# EasyEDA Pro project honglin-first_crt_smartphone-e4cb491d.epro, board PCB_CRT手机
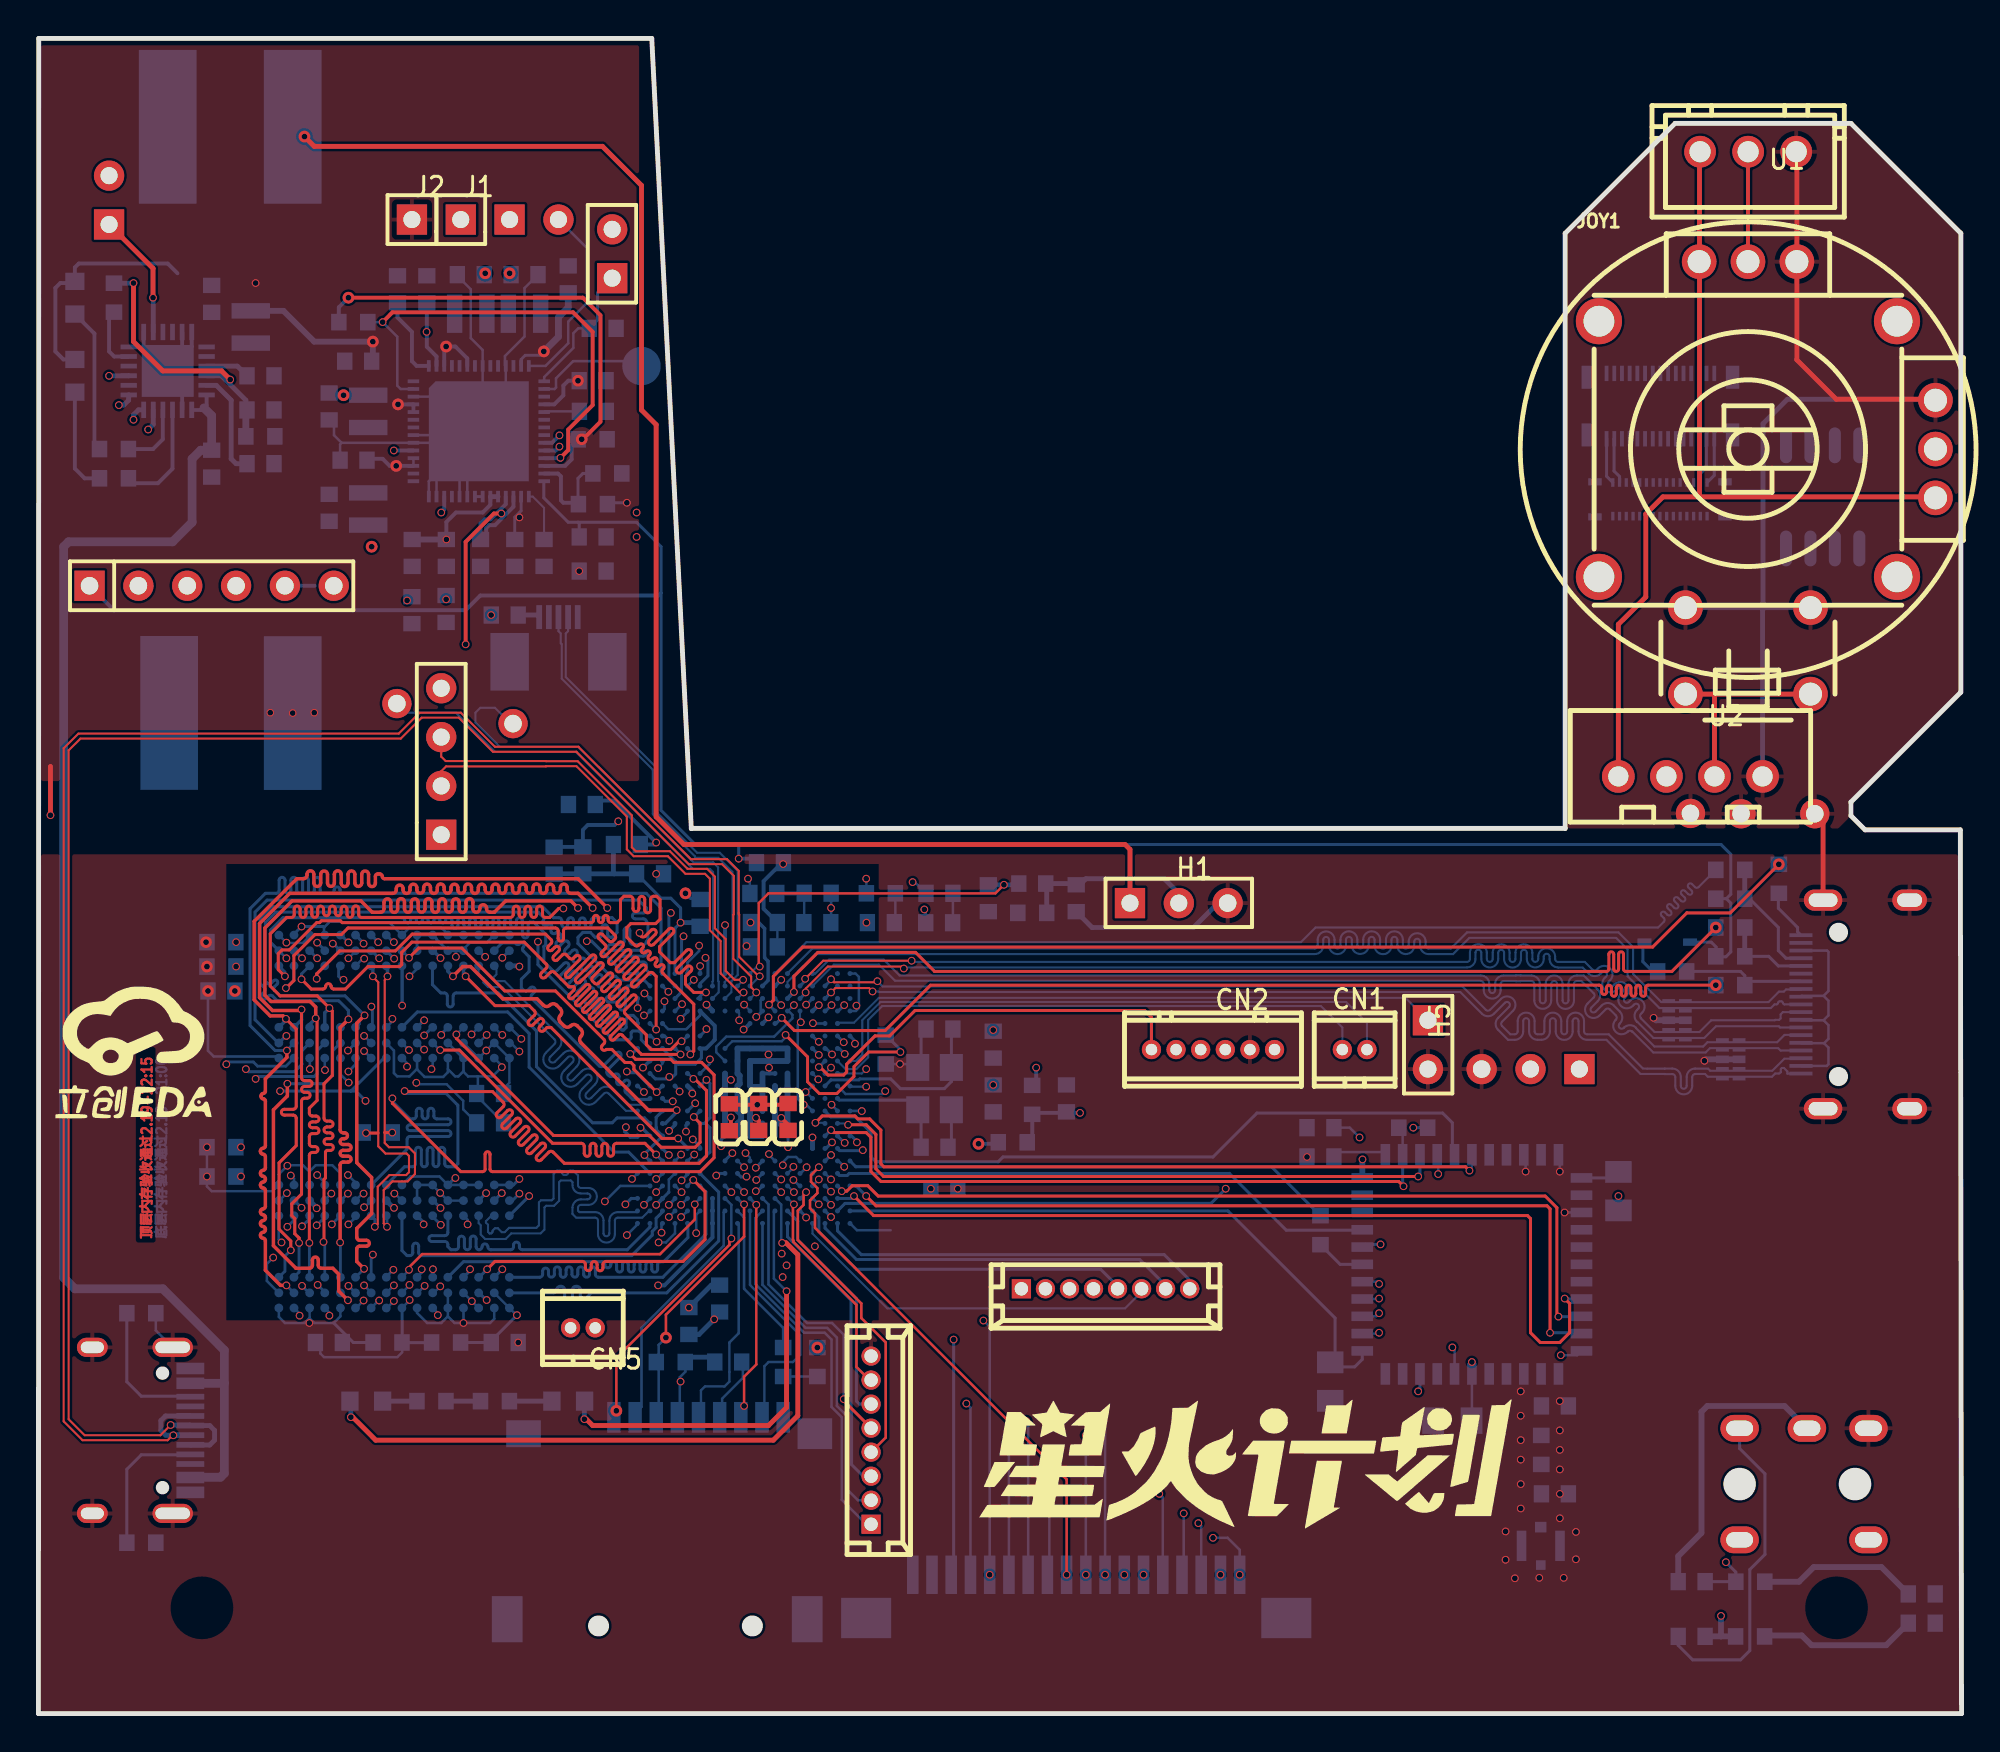
[diagram p7: board, top side]
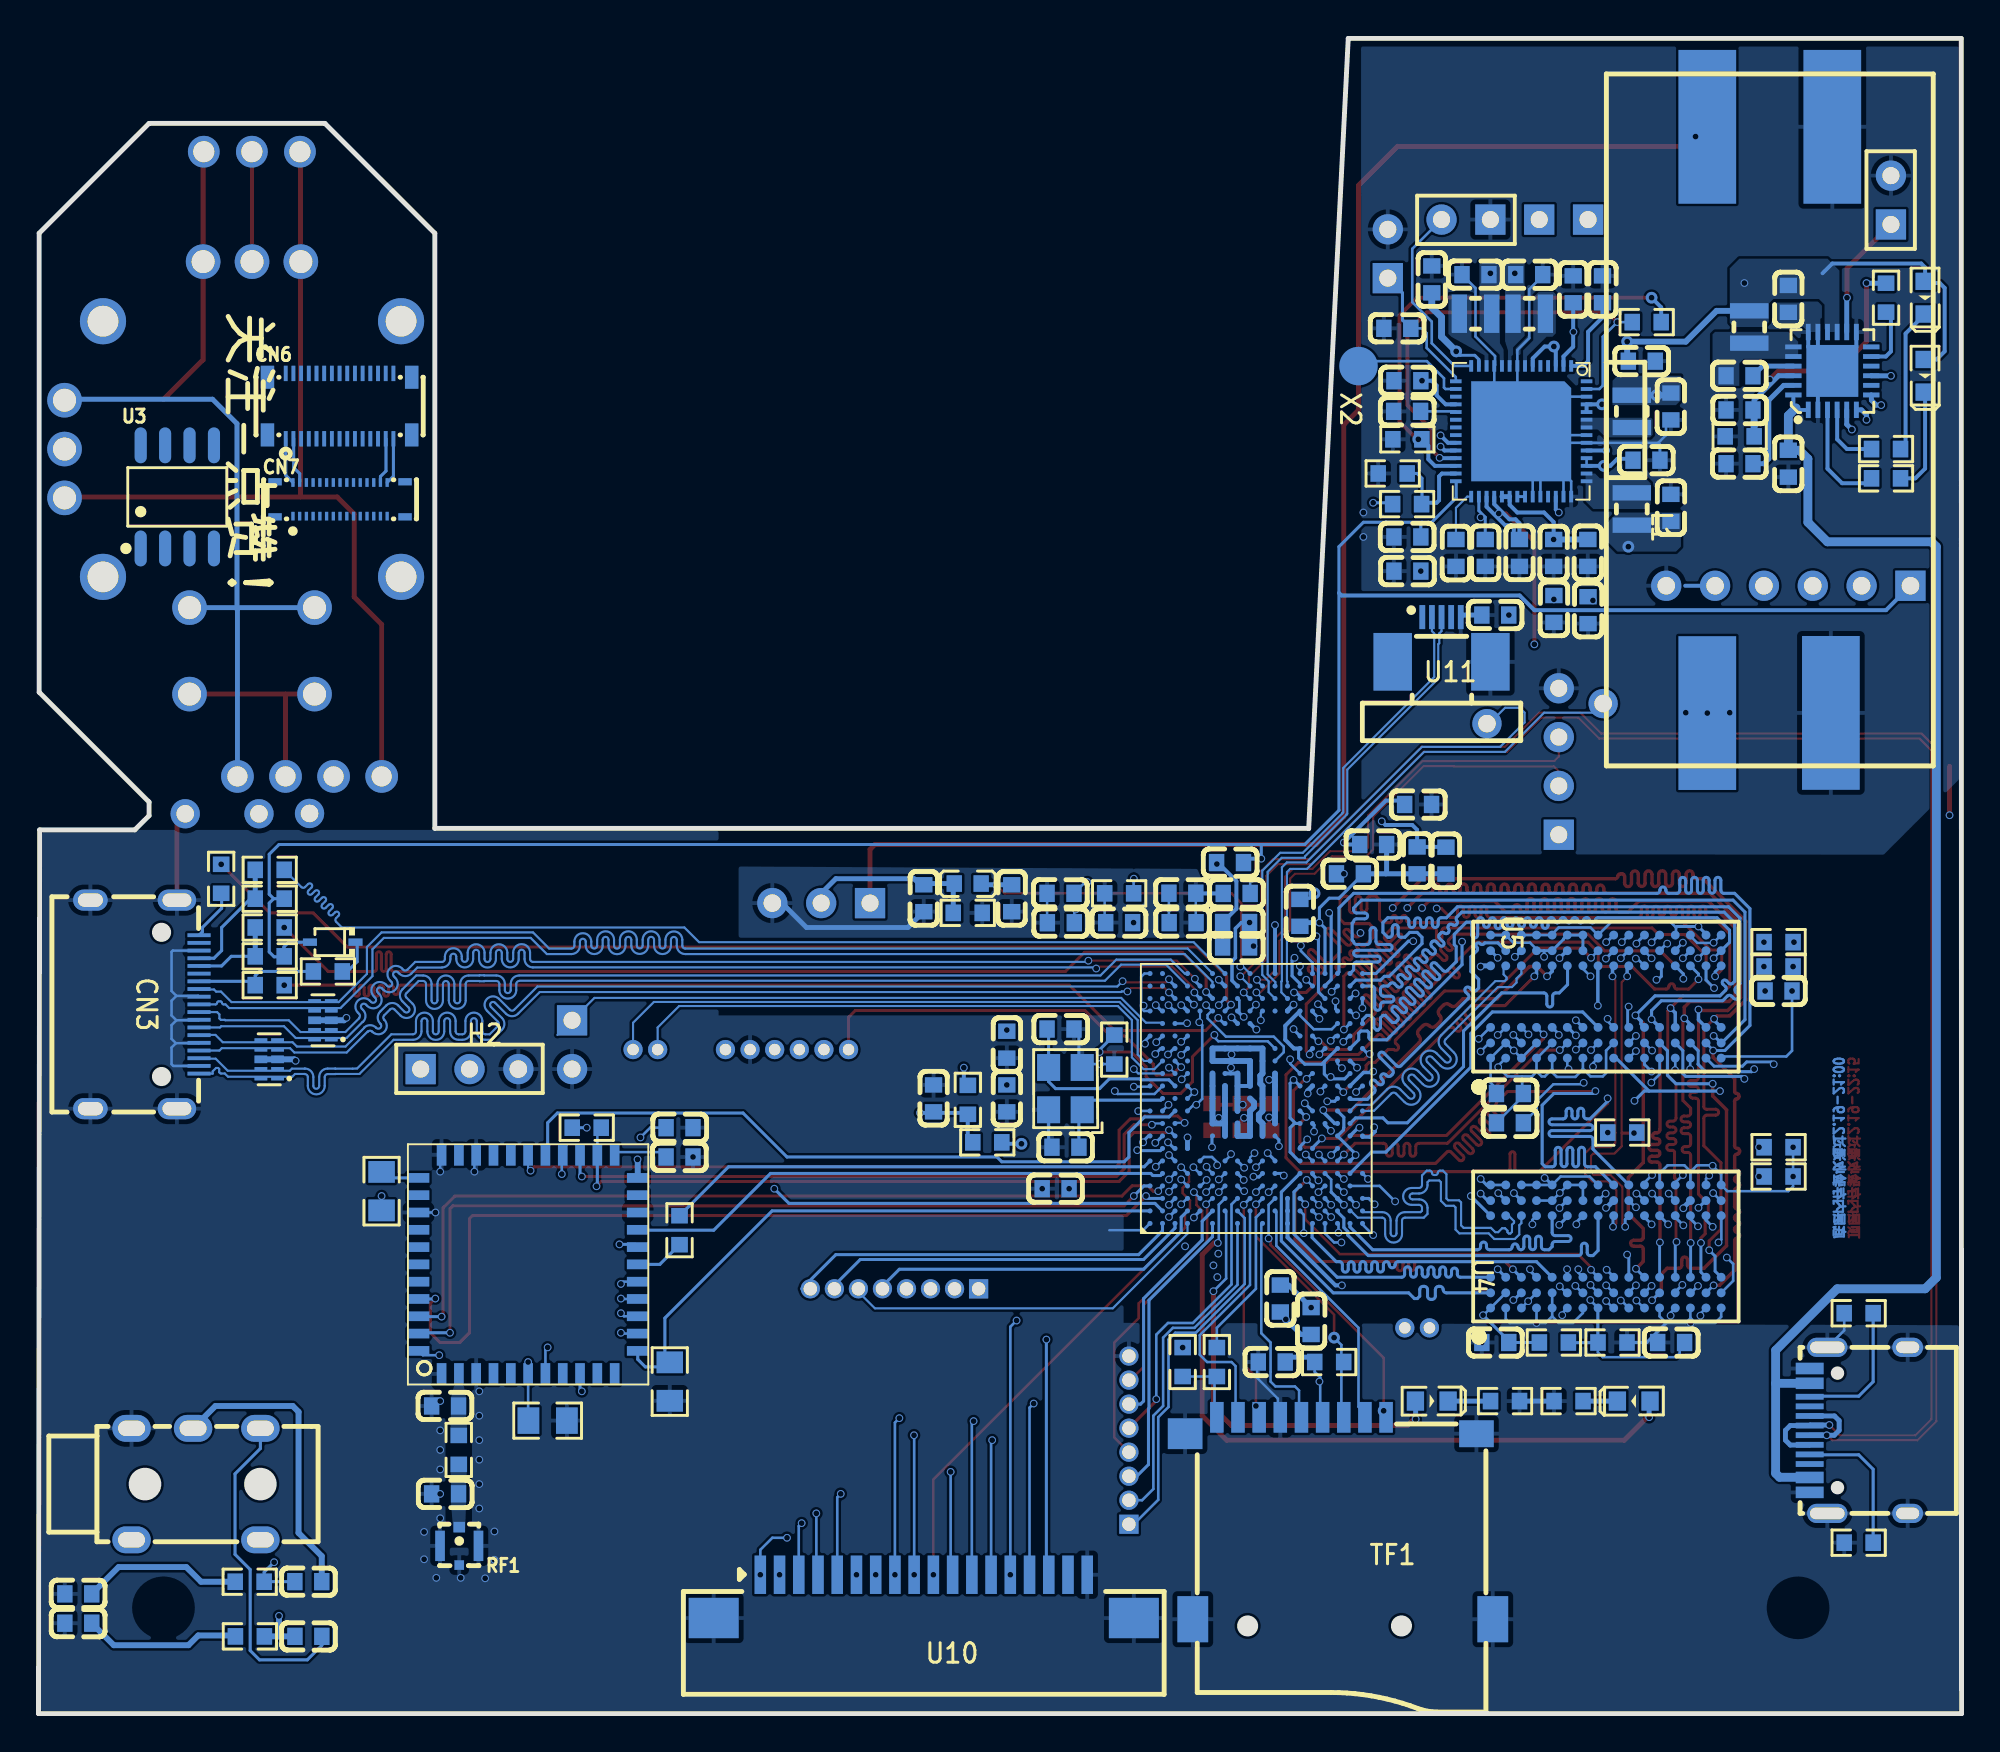
[diagram p8: board, bottom side, seen from below]

Outline 100 x 87.15 mm; copper layers: Top Layer, Inner1, Inner2, Inner3, Inner4, Bottom Layer. Coordinates in mm from the lower left corner of the outline.
Outline path: 0,0 100,0 99.94,45.97 94.99,45.97 94.25,46.71 94.25,47.42 99.96,53.14 99.96,77.01 94.25,82.73 85.1,82.73 79.39,77.01 79.39,46.05 33.96,46.05 33.95,46.04 31.89,87.15 0.01,87.15 0,0
Stack: Top Layer 0.035mm / Dielectric1 0.274mm PP er 4.5 / Inner1 0.035mm / Dielectric2 0.274mm PP er 4.5 / Inner2 0.035mm / Dielectric3 0.274mm FR4 er 4.5 / Inner3 0.035mm / Dielectric4 0.274mm PP er 4.5 / Inner4 0.035mm / Dielectric5 0.274mm PP er 4.5 / Bottom Layer 0.035mm

## Design rules (mm)
net H1: DP10
net H2: DP10
net H3: DP9
net H4: DP9
net H5: DP8
net H6: DP8
net H7: DP7
net H8: DP7
net SCKP: DP2
net SCKN: DP2
net USB_4G_MODULE_DP: DP11
net SDQS2P: DP4
net SDQS2N: DP4
net SDQS0N: DP6
net USB_MAIN_D-: DP14
net USB_MAIN_D+: DP14
net USB_KEYBOARD_D-: DP12
net USB_KEYBOARD_D+: DP12
net USB_4G_MODULE_DM: DP11
net SDQS1P: DP5
net SDQS3N: DP1
net SDQS0P: DP6
net SCKE1: DP3
net SDQS1N: DP5
net SCKE0: DP3
net SDQS3P: DP1
net $5N103: DP13
net $5N104: DP13
spacing Default (default): track to track 0.089, other pairs 0 to 0.152
spacing Plane_Default: track to track 0.089, other pairs 0 to 0.152
spacing Copper_copperRegion: track to track 0.089, other pairs 0 to 0.152
track width Default (default): min 0.089, default 0.178, max 25.4
differential pair 表层差分对: width min 0.109, default 0.109, max 2.54; gap min 0.152, default 0.152
differential pair 内层差分对 (default): width min 0.107, default 0.107, max 2.54; gap min 0.1, default 0.178
net SCS0 uses SA规则
net SA10 uses SA规则
net SDQ12 uses SDQ长度规则
net SDQ25 uses SDQ长度规则
net SDQ26 uses SDQ长度规则
net SDQ21 uses SDQ长度规则
net SDQ8 uses SDQ长度规则
net SDQ10 uses SDQ长度规则
net SDQ9 uses SDQ长度规则
net SDQ0 uses SDQ长度规则
net SODT1 uses SA规则
net SA7 uses SA规则
net SDQ5 uses SDQ长度规则
net SDQM0 uses SDQ长度规则
net SDQ2 uses SDQ长度规则
net SDQ13 uses SDQ长度规则
net SDQ15 uses SDQ长度规则
net SA6 uses SA规则
net SCAS uses SA规则
net SCS1 uses SA规则
net SODT0 uses SA规则
net SDQM3 uses SDQ长度规则
net SDQ4 uses SDQ长度规则
net SDQ1 uses SDQ长度规则
net SDQ20 uses SDQ长度规则
net SDQ19 uses SDQ长度规则
net SDQ17 uses SDQ长度规则
net SA4 uses SA规则
net SA15 uses SA规则
net SDQ6 uses SDQ长度规则
net SDQ3 uses SDQ长度规则
net SDQ23 uses SDQ长度规则
net SDQM2 uses SDQ长度规则
net SDQ18 uses SDQ长度规则
net SRAS uses SA规则
net SA2 uses SA规则
net SA3 uses SA规则
net SA9 uses SA规则
net SDQM1 uses SDQ长度规则
net SDQ11 uses SDQ长度规则
net SDQ29 uses SDQ长度规则
net SDQ31 uses SDQ长度规则
net SA1 uses SA规则
net SA8 uses SA规则
net SA13 uses SA规则
net SA5 uses SA规则
net SDQ7 uses SDQ长度规则
net SDQ14 uses SDQ长度规则
net SDQ22 uses SDQ长度规则
net SDQ27 uses SDQ长度规则
net SDQ16 uses SDQ长度规则
net SDQ30 uses SDQ长度规则
net SCKE1 uses SA规则
net SA14 uses SA规则
net SA12 uses SA规则
net SA11 uses SA规则
net SA0 uses SA规则
net SDQ28 uses SDQ长度规则
net SDQ24 uses SDQ长度规则
net SCKE0 uses SA规则
net SWE uses SA规则
pour e6898 uses Copper_copperRegion
pour e6953 uses Copper_copperRegion
pour e6983 uses Copper_copperRegion
pour e7125 uses Copper_copperRegion
pour e7131 uses Copper_copperRegion
pour e7165 uses Copper_copperRegion
pour e7350 uses Copper_copperRegion
pour e7438 uses Copper_copperRegion

## Placement (name value [footprint] x y rotation side)
C-AVCC-1  10uf 10v  [C0603]  46.85 42.67 180 bottom
C-AVCC-2  1uF  [C0603]  37.69 42.67 180 bottom
C-AVCC-3  470nF  [C0603]  46.84 41.14 180 bottom
C-AVCC-4  470nF  [C0603]  43.8 41.15 180 bottom
C-AVCC-5  470nF  [C0603]  53.96 42.42 90 bottom
C-AVCC-6  470nF  [C0603]  49.39 42.42 90 bottom
C-FILTER-1  47nF  [C0603]  9.51 37.59 180 bottom
C-FILTER-2  47nF  [C0603]  37.72 41.15 0 bottom
C-FILTER-3  47nF  [C0603]  24.25 19.3 0 bottom
C-FILTER-4  47nF  [C0603]  49.65 34.8 270 bottom
C-FILTER-5  47nF  [C0603]  21.2 57.47 270 bottom
C-FILTER-6  47nF  [C0603]  38.04 44.27 0 bottom
C-FILTER-7  47nF  [C0603]  31.8 43.69 180 bottom
C-FILTER-8  47nF  [C0603]  28.26 47.3 0 bottom
C-FILTER-9  47nF  [C0603]  24.25 57.15 180 bottom
C-FILTER-10  1uF  [C0603]  37.72 39.88 0 bottom
C-FILTER-11  1uF  [C0603]  19.42 57.4 270 bottom
C-FILTER-12  1uF  [C0603]  34.41 41.66 90 bottom
C-FILTER-13  1uF  [C0603]  35.42 21.59 270 bottom
C-FILTER-14  1uF  [C0603]  66.66 30.48 0 bottom
C-FILTER-15  1uF  [C0603]  35.92 31.02 270 top
C-FILTER-16  1uF  [C0603]  23.48 32.26 0 bottom
C-FILTER-17  1uF  [C0603]  47.11 27.31 180 bottom
C-FILTER-18  47uf  [C0603]  33.82 20.42 270 bottom
C-FILTER-19  1uF  [C0603]  28.31 44.39 90 bottom
C-FILTER-20  1uF  [C0603]  40.5 41.15 180 bottom
C-FILTER-21  1uF  [C0603]  40.52 42.68 0 bottom
C-FILTER-22  47nF  [C0603]  23.48 30.73 0 bottom
C-FILTER-23  47nF  [C0603]  15.1 19.3 0 bottom
C-PLL-1  12P  [C0603]  46.85 35.61 0 bottom
C-PLL-2  12P  [C0603]  46.6 29.46 0 bottom
C-PLL-3  220nF  [C0603]  49.65 32 270 bottom
C-POWER-1  10uf 10v  [C0603]  19.43 60.38 270 bottom
C-POWER-2  47uf  [C0603]  15.11 68 90 bottom
C-POWER-3  10uf 10v  [C0603]  21.21 60.38 90 bottom
C-POWER-4  10uf 10v  [C0603]  16.63 70.36 180 bottom
C-POWER-5  10uf 10v  [C0603]  28.82 59.44 0 bottom
C-POWER-6  10uf 10v  [C0603]  28.82 61.21 180 bottom
C-POWER-7  10uf 10v  [C0603]  22.99 60.38 270 bottom
C-POWER-8  10uf 10v  [C0603]  20.19 74.1 90 bottom
C-POWER-9  10uf 10v  [C0603]  18.67 74.1 90 bottom
C-POWER-10  10uf 10v  [C0603]  28.83 67.75 0 bottom
C-POWER-11  10uf 10v  [C0603]  24.77 60.38 270 bottom
C-POWER-12  10uf 10v  [C0603]  28.82 69.34 0 bottom
C-POWER-13  10uf 10v  [C0603]  27.55 74.61 90 bottom
C-POWER-14  10uf 10v  [C0603]  16.38 65.21 180 bottom
C-POWER-15  47uf  [C0603]  25.27 74.86 180 bottom
C-POWER-16  47uf  [C0603]  22.48 74.86 0 bottom
C-POWER-17  47uf  [C0603]  15.11 62.73 270 bottom
C-POWER-18  1uf 10v  [C0603]  26.29 60.38 90 bottom
C-POWER-19  10uf 10v  [C0603]  11.55 65.02 180 bottom
C-POWER-20  47nF  [C0603]  11.55 69.6 180 bottom
C-POWER-21  4.7uF  [C0603]  11.55 67.82 0 bottom
C-POWER-22  47uf  [C0603]  9.01 73.6 90 bottom
C-POWER-23  4.7uF  [C0603]  9.01 65.02 90 bottom
C-POWER-24  47uf  [C0603]  37.45 31.04 270 top
C-POWER-25  47uf  [C0603]  26.81 44.37 90 bottom
C-POWER-26  47uf  [C0603]  38.98 31.04 90 top
C-POWER-27  47uf  [C0603]  30.6 45.21 180 bottom
C-RESET-1  1nF  [C0603]  53.46 32 270 bottom
C-RESET-2  1nF  [C0603]  29.34 72.06 180 bottom
C-SOUND-1  1uF  [C0603]  85.97 6.86 0 bottom
C-SOUND-2  1uF  [C0603]  85.97 4.02 0 bottom
C-SOUND-3  47nF  [C0603]  97.93 6.23 180 bottom
C-SOUND-4  47nF  [C0603]  97.93 4.7 180 bottom
C_SD_1  10uf 10v  [C0603]  35.87 18.29 0 bottom
C_WIFI_1  NC  [C0603]  78.86 11.43 0 bottom
C_WIFI_2  NC  [C0603]  78.86 16 180 bottom
C_WIFI_3  47nF  [C0603]  66.66 28.96 180 bottom
CN1  Uart5  [CONN-TH_2P-P1.25_1.25T-2P-DP]  68.44 34.54 180 top
CN2  SPI引出  [CONN-TH_6P-P1.25_1.25T-6P-DP]  61.08 34.54 0 top
CN3  A71-05H4-111N1  [HDMI-SMD_A71-05H4-111N1]  94.47 36.89 270 bottom
CN4  KH-PJ-313  [AUDIO-TH_KH-PJ-313]  91.81 11.94 180 bottom
CN5  Uart5  [CONN-TH_2P-P1.25_1.25T-2P-DP]  28.31 20.07 180 top
CN6  AXT330124  [CONN-SMD_30P-P0.40_AXT330124]  84.34 68.02 180 bottom
CN7  X3500FVS-30A-LPV01  [CONN-SMD_30P-P0.35_XKB_X3500FVS-30A-LPV01]  84.32 63.17 180 bottom
D44  B5819WS_C169530  [SOD-323F_L2.0-W1.6-LS2.5-RD]  84.7 40.13 0 bottom
D45  RCLAMP0524P_C907837  [DFN2510-10_L2.5-W1.0-P0.50-BL]  88 34.04 90 bottom
D46  RCLAMP0524P_C907837  [DFN2510-10_L2.5-W1.0-P0.50-BL]  85.21 36.07 90 bottom
H1  屏幕接口  [HDR-F-2.54_1X3]  59.3 42.16 0 top
H2  Debug  [HDR-F-2.54_1X3]  77.59 33.53 180 bottom
H3  锂电池  [HDR-F-2.54_1X2]  3.67 78.74 90 bottom
H4  USB摄像头  [HDR-F-2.54_1X4]  20.94 49.53 90 top
H5  FEL下载模式  [HDR-F-2.54_1X2]  72.25 34.8 270 top
H6  复位  [HDR-F-2.54_1X2]  29.83 75.95 90 top
H7  Wake UP 可选  [HDR-F-2.54_1X2]  25.77 77.72 0 bottom
J1  使能屏幕  [HDR-M-2.54_1X1]  21.96 77.72 0 top
J2  电池供电  [HDR-M-2.54_1X1]  19.42 77.72 0 top
J3  Pin06  [PIN06]  9.01 58.67 90 top
JOY1  -  [joy]  88.89 65.79 0 top
JP1  串口和SPI  [CONN-TH_8P-P1.25_1.25T-1-8A]  55.49 22.1 0 top
JP2  IIC和GPIO  [CONN-TH_8P-P1.25_1.25T-1-8A]  43.3 14.22 90 top
L1  1.5uH  [IND-SMD_L2.0-W1.6_SUMIDA_201610CDMCDDS]  17.15 62.67 270 bottom
L2  1.5uH  [IND-SMD_L2.0-W1.6_SUMIDA_201610CDMCDDS]  11.04 72.14 90 bottom
L3  1.5uH  [IND-SMD_L2.0-W1.6_SUMIDA_201610CDMCDDS]  17.15 67.75 90 bottom
L4  1.5uH  [IND-SMD_L2.0-W1.6_SUMIDA_201610CDMCDDS]  22.48 72.83 0 bottom
L5  1.5uH  [IND-SMD_L2.0-W1.6_SUMIDA_201610CDMCDDS]  25.27 72.83 180 bottom
L6  默认一坨锡短路  [L0603]  51.68 43.18 0 bottom
LED1  LED-0603_R  [LED0603_RED]  27.55 16.26 180 bottom
LED2  LED-0603_G  [LED0603_GREEN]  17.05 16.26 0 bottom
LED3  LED-0603_G  [LED0603_GREEN]  1.89 69.6 270 bottom
LED4  LED-0603_R  [LED0603_RED]  1.89 73.66 270 bottom
NOREF  -  [Pad_e493]  18.64 52.55 0 top
NOREF#2  -  [Pad_e492]  24.68 51.5 0 top
NOREF#3  -  [Pad_e496]  85.9 46.83 0 top
NOREF#4  -  [Pad_e495]  88.53 46.81 0 top
NOREF#5  -  [Pad_e494]  92.37 46.81 0 top
R-AV-1  150k  [R0603]  43.8 42.67 180 bottom
R-AV-2  100Ω  [R0603]  51.68 41.66 180 bottom
R-POWER-1  10kΩ  [R0603]  28.82 66.29 180 bottom
R-POWER-2  10kΩ  [R0603]  16.37 72.39 180 bottom
R-POWER-3  10kΩ  [R0603]  3.93 73.66 270 bottom
R-POWER-4  10kΩ  [R0603]  11.54 66.45 180 bottom
R-POWER-5  10kΩ  [R0603]  5.35 20.83 180 bottom
R-POWER-6  10kΩ  [R0603]  5.35 8.89 180 bottom
R-POWER-7  10kΩ  [R0603]  28.83 62.92 0 bottom
R-POWER-8  10kΩ  [R0603]  29.58 64.52 0 bottom
R-RESET-1  10kΩ  [R0603]  50.66 29.72 180 bottom
R-RESET-2  100Ω  [R0603]  51.67 31.93 270 bottom
R_HDMI_1  1k  [R0603]  90.5 43.43 90 bottom
R_HDMI_2  100  [R0603]  87.97 40.89 180 bottom
R_HDMI_3  100  [R0603]  87.97 43.89 180 bottom
R_HDMI_4  1k8  [R0603]  87.97 39.39 180 bottom
R_HDMI_5  1k8  [R0603]  87.97 42.39 180 bottom
R_HDMI_6  100  [R0603]  87.97 37.89 180 bottom
R_HDMI_7  27K  [R0603]  84.95 38.61 180 bottom
R_LED_1  1k  [R0603]  20.44 16.26 0 bottom
R_LED_2  1k  [R0603]  23.74 16.26 180 bottom
R_LED_3  1k  [R0603]  3.93 65.79 0 bottom
R_LED_4  1k  [R0603]  3.93 64.26 0 bottom
R_SD_1  510  [R0603]  38.72 18.29 90 bottom
R_SD_2  100k  [R0603]  32.88 18.29 180 bottom
R_SD_3  100k  [R0603]  40.5 18.29 270 bottom
R_SOUND_1  33Ω  [R0603]  89.02 6.86 0 bottom
R_SOUND_2  33Ω  [R0603]  89.01 4.02 0 bottom
R_WIFI_1  33Ω  [R0603]  66.66 25.15 90 bottom
R_WIFI_2  100k  [R0805]  67.17 17.27 90 bottom
R_WIFI_3  0  [R0805]  82.16 27.18 90 bottom
R_WIFI_4  100k  [R0805]  73.52 15.24 0 bottom
R_WIFI_5  0  [R0603]  78.15 13.72 90 bottom
R_WIFI_6  10kΩ  [R0603]  71.49 30.48 180 bottom
RF1  HC-RF-IPEX2020-04  [IPEX-SMD_HC-RF-IPEX2020-04]  78.12 8.71 0 bottom
RRAM1  240  [R0603]  9.51 27.94 0 bottom
RRAM2  240  [R0603]  9.51 29.46 0 bottom
RRAM3  240  [R0603]  9.51 40.13 0 bottom
RRAM4  240  [R0603]  9.51 38.86 0 bottom
RRAM5  240  [R0603]  44.06 34.54 90 bottom
RRAM6  1k  [R0603]  21.2 19.3 180 bottom
RRAM7  1k  [R0603]  18.15 19.3 180 bottom
RRAM8  100  [R0603]  17.64 30.23 180 bottom
TF1  SD  [TF-SMD_TF-15-15]  32.37 10.16 270 bottom
U1  XH2.54-3P 直插  [CONN-TH_XH2.54-3P]  88.9 81.25 0 top
U2  XH2.54_4P_直插  [CONN-TH_4P-P2.50-XH2.54-4P]  85.9 48.75 180 top
U3  H616  [SOP-8_L4.9-W3.9-P1.27-LS6.0-BL]  92.78 63.3 180 bottom
U3#2  -  [H616]  37 32 180 bottom
U4  -  [K4B4G1646E]  20.5 23.5 90 bottom
U5  -  [K4B4G1646E]  20.5 36.5 90 bottom
U6  BQ25601DRTWR  [WQFN-24_L4.0-W4.0-P0.50-TL-EP2.7]  6.72 69.85 90 bottom
U7  AXP305 COPY  [AXP305]  22.9 66.71 270 bottom
U8  -  [升压模块[MT3608]]  8.5 67.31 90 bottom
U9  -  [AW859A]  74.54 23.37 90 bottom
U10  以太网引出  [FPC-SMD_XUNPU_FPC-1.0AS-18PWBH25]  53.96 6.1 180 bottom
U11  USB网卡  [FPC-SMD_5P-P0.50_XUNPU_FPC-0.5AX-5PWBH20]  27.04 55.88 180 bottom
USB1  USB充电  [USB-C-SMD_TYPEC-304-BCP16]  5.35 14.73 90 bottom
X2  TP  [TP_SMD]  31.36 70.1 270 bottom
X3  24MHz  [OSC-SMD_4P-L3.2-W2.5-BL]  46.6 32.51 90 bottom

## Footprints (pads in the part's own frame, mm; a bottom-side part is the same pattern mirrored in y, then rotated)
AUDIO-TH_KH-PJ-313
  oval 2x1.4 hole 1.4x0.8: 1(-3.35,2.9) 2(3.35,2.9) 3(-0.15,2.9) 4(-3.35,-2.9) 5(3.35,-2.9)
AW859A
  rect 1.125x0.5 smd: 1(-5.7,4.5) 2(-5.7,3.6) 3(-5.7,2.7) 4(-5.7,1.8) 5(-5.7,0.9) 6(-5.7,0) 7(-5.7,-0.9) 8(-5.7,-1.8) 9(-5.7,-2.7) 10(-5.7,-3.6) 11(-5.7,-4.5) 23(5.7,-4.5) 24(5.7,-3.6) 25(5.7,-2.7) 26(5.7,-1.8) 27(5.7,-0.9) 28(5.7,0) 29(5.7,0.9) 30(5.7,1.8) 31(5.7,2.7) 32(5.7,3.6) 33(5.7,4.5)
  rect 0.5x1.125 smd: 12(-4.5,-5.7) 13(-3.6,-5.7) 14(-2.7,-5.7) 15(-1.8,-5.7) 16(-0.9,-5.7) 17(0,-5.7) 18(0.9,-5.7) 19(1.8,-5.7) 20(2.7,-5.7) 21(3.6,-5.7) 22(4.5,-5.7) 34(4.5,5.7) 35(3.6,5.7) 36(2.7,5.7) 37(1.8,5.7) 38(0.9,5.7) 39(0,5.7) 40(-0.9,5.7) 41(-1.8,5.7) 42(-2.7,5.7) 43(-3.6,5.7) 44(-4.5,5.7)
AXP305
  rect 0.6x0.2 smd: 1(-3.4,2.6) 2(-3.4,2.2) 3(-3.4,1.8) 4(-3.4,1.4) 5(-3.4,1) 6(-3.4,0.6) 7(-3.4,0.2) 8(-3.4,-0.2) 9(-3.4,-0.6) 10(-3.4,-1) 11(-3.4,-1.4) 12(-3.4,-1.8) 13(-3.4,-2.2) 14(-3.4,-2.6) 29(3.4,-2.6) 30(3.4,-2.2) 31(3.4,-1.8) 32(3.4,-1.4) 33(3.4,-1) 34(3.4,-0.6) 35(3.4,-0.2) 36(3.4,0.2) 37(3.4,0.6) 38(3.4,1) 39(3.4,1.4) 40(3.4,1.8) 41(3.4,2.2) 42(3.4,2.6)
  rect 0.2x0.6 smd: 15(-2.6,-3.4) 16(-2.2,-3.4) 17(-1.8,-3.4) 18(-1.4,-3.4) 19(-1,-3.4) 20(-0.6,-3.4) 21(-0.2,-3.4) 22(0.2,-3.4) 23(0.6,-3.4) 24(1,-3.4) 25(1.4,-3.4) 26(1.8,-3.4) 27(2.2,-3.4) 28(2.6,-3.4) 43(2.6,3.4) 44(2.2,3.4) 45(1.8,3.4) 46(1.4,3.4) 47(1,3.4) 48(0.6,3.4) 49(0.2,3.4) 50(-0.2,3.4) 51(-0.6,3.4) 52(-1,3.4) 53(-1.4,3.4) 54(-1.8,3.4) 55(-2.2,3.4) 56(-2.6,3.4)
  custom 5.2x5.2 smd: 57(0,0)
C0603
  rect 0.8x0.9 smd: 1(-0.7,0) 2(0.7,0)
CONN-SMD_30P-P0.35_XKB_X3500FVS-30A-LPV01
  rect 0.17x0.45 smd: 1(-2.45,-0.875) 2(-2.45,0.875) 3(-2.1,-0.875) 4(-2.1,0.875) 5(-1.75,-0.875) 6(-1.75,0.875) 7(-1.4,-0.875) 8(-1.4,0.875) 9(-1.05,-0.875) 10(-1.05,0.875) 11(-0.7,-0.875) 12(-0.7,0.875) 13(-0.35,-0.875) 14(-0.35,0.875) 15(0,-0.875) 16(0,0.875) 17(0.35,-0.875) 18(0.35,0.875) 19(0.7,-0.875) 20(0.7,0.875) 21(1.05,-0.875) 22(1.05,0.875) 23(1.4,-0.875) 24(1.4,0.875) 25(1.75,-0.875) 26(1.75,0.875) 27(2.1,-0.875) 28(2.1,0.875) 29(2.45,-0.875) 30(2.45,0.875)
  rect 0.7x0.375 smd: 31(3.38,-0.912) 31(3.38,0.912) 32(-3.38,-0.912) 32(-3.38,0.912)
CONN-SMD_30P-P0.40_AXT330124
  rect 0.2x0.8 smd: 1(-2.8,-1.7) 2(-2.8,1.7) 3(-2.4,-1.7) 4(-2.4,1.7) 5(-2,-1.7) 6(-2,1.7) 7(-1.6,-1.7) 8(-1.6,1.7) 9(-1.2,-1.7) 10(-1.2,1.7) 11(-0.8,-1.7) 12(-0.8,1.7) 13(-0.4,-1.7) 14(-0.4,1.7) 15(0,-1.7) 16(0,1.7) 17(0.4,-1.7) 18(0.4,1.7) 19(0.8,-1.7) 20(0.8,1.7) 21(1.2,-1.7) 22(1.2,1.7) 23(1.6,-1.7) 24(1.6,1.7) 25(2,-1.7) 26(2,1.7) 27(2.4,-1.7) 28(2.4,1.7) 29(2.8,-1.7) 30(2.8,1.7)
  rect 0.7x1.2 smd: 31(3.75,-1.5) 32(3.75,1.5) 33(-3.75,-1.5) 34(-3.75,1.5)
CONN-TH_2P-P1.25_1.25T-2P-DP
  round 1 hole 0.6: 1(-0.64,0) 2(0.64,0)
CONN-TH_4P-P2.50-XH2.54-4P
  round 1.7 hole 1.05: 1(3.75,0) 2(1.25,0) 3(-1.25,0) 4(-3.75,0)
CONN-TH_6P-P1.25_1.25T-6P-DP
  round 1 hole 0.6: 1(-3.2,0) 2(-1.92,0) 3(-0.64,0) 4(0.64,0) 5(1.921,0) 6(3.2,0)
CONN-TH_8P-P1.25_1.25T-1-8A
  rect 1x1 hole 0.7: 1(-4.375,0)
  round 1 hole 0.7: 2(-3.125,0) 3(-1.875,0) 4(-0.625,0) 5(0.625,0) 6(1.875,0) 7(3.125,0) 8(4.375,0)
CONN-TH_XH2.54-3P
  round 1.65 hole 1.1: 1(-2.5,0) 2(0,0) 3(2.5,0)
DFN2510-10_L2.5-W1.0-P0.50-BL
  rect 0.2x0.665 smd: 1(-1,-0.433) 2(-0.5,-0.433) 4(0.5,-0.433) 5(1,-0.433) 6(1,0.433) 7(0.5,0.433) 9(-0.5,0.433) 10(-1,0.433)
  rect 0.4x0.665 smd: 3(0,-0.433) 8(0,0.433)
FPC-SMD_5P-P0.50_XUNPU_FPC-0.5AX-5PWBH20
  rect 0.3x1.25 smd: 1(-1,1.163) 2(-0.5,1.163) 3(0,1.163) 4(0.5,1.163) 5(1,1.163)
  rect 2x3 smd: 6(2.54,-1.163) 7(-2.54,-1.163)
FPC-SMD_XUNPU_FPC-1.0AS-18PWBH25
  rect 0.6x2 smd: 1(-8.5,1.125) 2(-7.5,1.125) 3(-6.5,1.125) 4(-5.5,1.125) 5(-4.5,1.125) 6(-3.5,1.125) 7(-2.5,1.125) 8(-1.5,1.125) 9(-0.5,1.125) 10(0.5,1.125) 11(1.5,1.125) 12(2.5,1.125) 13(3.5,1.125) 14(4.5,1.125) 15(5.5,1.125) 16(6.5,1.125) 17(7.5,1.125) 18(8.5,1.125)
  rect 2.6x2.1 smd: 19(10.925,-1.125) 20(-10.925,-1.125)
H616
  round 0.26 smd: A1(-5.2,-6.5) A2(-5.2,-5.85) A4(-5.2,-4.55) A6(-5.2,-3.25) A8(-5.2,-1.95) A10(-5.2,-0.65) A12(-5.2,0.65) A14(-5.2,1.95) A16(-5.2,3.25) A18(-5.2,4.55) A19(-5.2,5.2) A20(-5.2,5.85) A21(-5.2,6.5) B1(-4.55,-6.5) B2(-4.55,-5.85) B3(-4.55,-5.2) B4(-4.55,-4.55) B5(-4.55,-3.9) B6(-4.55,-3.25) B7(-4.55,-2.6) B8(-4.55,-1.95) B9(-4.55,-1.3) B10(-4.55,-0.649) B11(-4.55,0) B12(-4.55,0.65) B13(-4.55,1.3) B14(-4.55,1.95) B15(-4.55,2.6) B16(-4.55,3.25) B17(-4.55,3.9) B18(-4.55,4.55) B19(-4.55,5.2) B20(-4.55,5.85) B21(-4.55,6.5) C1(-3.9,-6.5) C2(-3.9,-5.85) C3(-3.9,-5.2) C4(-3.9,-4.55) C5(-3.9,-3.9) C6(-3.9,-3.25) C7(-3.9,-2.6) C8(-3.9,-1.95) C9(-3.9,-1.3) C10(-3.9,-0.65) C11(-3.9,0) C12(-3.9,0.65) C13(-3.9,1.3) C14(-3.9,1.95) C15(-3.9,2.6) C16(-3.9,3.25) C17(-3.9,3.9) C18(-3.9,4.55) C19(-3.9,5.2) C20(-3.9,5.85) D1(-3.25,-6.5) D2(-3.25,-5.85) D3(-3.25,-5.2) D4(-3.25,-4.55) D5(-3.25,-3.9) D7(-3.25,-2.6) D10(-3.25,-0.65) D11(-3.25,0) D12(-3.25,0.65) D13(-3.25,1.3) D14(-3.25,1.95) D15(-3.25,2.6) D16(-3.25,3.25) D18(-3.25,4.55) D19(-3.25,5.2) D20(-3.25,5.85) D21(-3.25,6.5) E2(-2.6,-5.85) E3(-2.6,-5.2) E4(-2.6,-4.55) E5(-2.6,-3.9) E6(-2.6,-3.25) E18(-2.6,4.55) E19(-2.6,5.2) E20(-2.6,5.85) F1(-1.95,-6.5) F2(-1.95,-5.85) F3(-1.95,-5.2) F4(-1.95,-4.55) F5(-1.95,-3.9) F8(-1.95,-1.95) F9(-1.95,-1.3) F10(-1.95,-0.65) F11(-1.95,0) F12(-1.95,0.65) F13(-1.95,1.3) F14(-1.95,1.95) F15(-1.95,2.6) F18(-1.95,4.55) F19(-1.95,5.2) F20(-1.95,5.85) F21(-1.95,6.5) G2(-1.3,-5.85) G3(-1.3,-5.2) G4(-1.3,-4.55) G5(-1.3,-3.9) G6(-1.3,-3.25) G8(-1.3,-1.95) G9(-1.3,-1.3) G10(-1.3,-0.65) G11(-1.3,0) G12(-1.3,0.65) G13(-1.3,1.3) G14(-1.3,1.95) G15(-1.3,2.6) G17(-1.3,3.9) G18(-1.3,4.55) G19(-1.3,5.2) G20(-1.3,5.85) G21(-1.3,6.5) H1(-0.65,-6.5) H2(-0.65,-5.85) H3(-0.65,-5.2) H4(-0.65,-4.55) H5(-0.65,-3.9) H6(-0.65,-3.25) H8(-0.65,-1.95) H9(-0.65,-1.3) H10(-0.65,-0.65) H11(-0.65,0) H12(-0.65,0.65) H13(-0.65,1.3) H14(-0.65,1.95) H15(-0.65,2.6) H17(-0.65,3.9) H18(-0.65,4.55) H19(-0.65,5.2) H20(-0.65,5.85) J2(0,-5.85) J3(0,-5.2) J6(0,-3.25) J8(0,-1.95) J9(0,-1.3) J10(0,-0.65) J11(0,0) J12(0,0.65) J13(0,1.3) J14(0,1.95) J15(0,2.6) J17(0,3.9) J18(0,4.55) J19(0,5.2) J20(0,5.85) J21(0,6.5) K1(0.65,-6.5) K2(0.65,-5.85) K3(0.65,-5.2) K4(0.65,-4.55) K5(0.65,-3.9) K6(0.65,-3.25) K8(0.65,-1.95) K9(0.65,-1.3) K10(0.65,-0.65) K11(0.65,0) K12(0.65,0.65) K13(0.65,1.3) K14(0.65,1.95) K15(0.65,2.6) K18(0.65,4.55) K19(0.65,5.2) K20(0.65,5.85) L2(1.3,-5.85) L3(1.3,-5.2) L4(1.3,-4.55) L5(1.3,-3.9) L6(1.3,-3.25) L8(1.3,-1.95) L9(1.3,-1.3) L10(1.3,-0.65) L11(1.3,0) L12(1.3,0.65) L13(1.3,1.3) L14(1.3,1.95) L15(1.3,2.6) L18(1.3,4.55) L19(1.3,5.2) L20(1.3,5.85) L21(1.3,6.5) M1(1.95,-6.5) M2(1.95,-5.85) M3(1.95,-5.2) M18(1.95,4.55) M19(1.95,5.2) M20(1.95,5.85) N2(2.6,-5.85) N3(2.6,-5.2) N4(2.6,-4.55) N5(2.6,-3.9) N6(2.6,-3.25) N7(2.6,-2.6) N9(2.6,-1.3) N10(2.6,-0.65) N12(2.6,0.65) N13(2.6,1.3) N15(2.6,2.6) N16(2.6,3.25) N18(2.6,4.55) N19(2.6,5.2) N20(2.6,5.85) N21(2.6,6.5) P1(3.25,-6.5) P2(3.25,-5.85) P3(3.25,-5.2) P4(3.25,-4.55) P5(3.25,-3.9) P6(3.25,-3.25) P7(3.25,-2.6) P9(3.25,-1.3) P10(3.25,-0.65) P12(3.25,0.65) P13(3.25,1.3) P15(3.25,2.6) P16(3.25,3.25) P18(3.25,4.55) P20(3.25,5.85) P21(3.25,6.5) R1(3.9,-6.5) R2(3.9,-5.85) R3(3.9,-5.2) R4(3.9,-4.55) R5(3.9,-3.9) R6(3.9,-3.25) R9(3.9,-1.3) R12(3.9,0.65) R15(3.9,2.6) R18(3.9,4.55) R19(3.9,5.2) R20(3.9,5.85) R21(3.9,6.5) T1(4.55,-6.5) T2(4.55,-5.85) T3(4.55,-5.2) T4(4.55,-4.55) T5(4.55,-3.9) T6(4.55,-3.25) T7(4.55,-2.6) T8(4.55,-1.95) T9(4.55,-1.3) T10(4.55,-0.65) T11(4.55,0) T12(4.55,0.65) T14(4.55,1.95) T15(4.55,2.6) T16(4.55,3.25) T17(4.55,3.9) T18(4.55,4.55) T20(4.55,5.85) T21(4.55,6.5) U1(5.2,-6.5) U2(5.2,-5.85) U3(5.2,-5.2) U4(5.2,-4.55) U5(5.2,-3.9) U6(5.2,-3.25) U8(5.2,-1.95) U9(5.2,-1.3) U10(5.2,-0.65) U11(5.2,0) U12(5.2,0.65) U13(5.2,1.3) U14(5.2,1.95) U15(5.2,2.6) U16(5.2,3.25) U17(5.2,3.9) U18(5.2,4.55) U19(5.2,5.2) U20(5.2,5.85) U21(5.2,6.5) V1(5.85,-6.5) V2(5.85,-5.85) V3(5.85,-5.2) V5(5.85,-3.9) V8(5.85,-1.95) V10(5.85,-0.65) V12(5.85,0.65) V15(5.85,2.6) V17(5.85,3.9) V19(5.85,5.2) V20(5.85,5.85) V21(5.85,6.5)
HDMI-SMD_A71-05H4-111N1
  rect 0.2x1.2 smd: 1(3.6,2.825) 2(3.2,2.825) 3(2.8,2.825) 4(2.4,2.825) 5(2,2.825) 6(1.6,2.825) 7(1.2,2.825) 8(0.8,2.825) 9(0.4,2.825) 10(0,2.825) 11(-0.4,2.825) 12(-0.8,2.825) 13(-1.2,2.825) 14(-1.6,2.825) 15(-2,2.825) 16(-2.4,2.825) 17(-2.8,2.825) 18(-3.2,2.825) 19(-3.6,2.825)
  oval 1.1x2 hole 0.7x1.5: 20(-5.425,1.675) 21(5.425,1.675)
  oval 1.1x1.8 hole 0.7x1.3: 22(-5.425,-2.825) 23(5.425,-2.825)
HDR-F-2.54_1X2
  rect 1.575x1.575 hole 0.889: 1(-1.27,0)
  round 1.575 hole 0.889: 2(1.27,0)
HDR-F-2.54_1X3
  rect 1.575x1.575 hole 0.889: 1(-2.54,0)
  round 1.575 hole 0.889: 2(0,0)
  round 1.575 hole 0.914: 3(2.54,0)
HDR-F-2.54_1X4
  rect 1.575x1.575 hole 0.889: 1(-3.81,0)
  round 1.575 hole 0.889: 2(-1.27,0) 3(1.27,0) 4(3.81,0)
HDR-M-2.54_1X1
  rect 1.575x1.575 hole 0.889: 1(0,0)
IND-SMD_L2.0-W1.6_SUMIDA_201610CDMCDDS
  rect 0.8x2 smd: 1(-0.84,0) 2(0.84,0)
IPEX-SMD_HC-RF-IPEX2020-04
  rect 0.6x0.55 smd: 1(0,-0.988)
  rect 0.5x1.58 smd: 2(1,-0.013) 3(-1,-0.013)
  rect 0.5x0.5 smd: 4(0,0.988)
joy
  round 1.8 hole 1.2: 1(9.75,-2.54) 2(9.75,0) 3(9.75,2.54) a(-3.25,-8.25) b(3.25,-8.25) c(-3.25,-12.75) d(3.25,-12.75)
  round 1.801 hole 1.199: 4(2.542,9.75) 5(0,9.75) 6(-2.538,9.75)
  round 2.4 hole 1.6: 7(-7.75,6.65) 8(-7.75,-6.65) 9(7.75,-6.65) 10(7.75,6.65)
K4B4G1646E
  round 0.457 smd: A1(-2.401,3.989) A2(-1.613,3.989) A3(-0.8,3.989) A7(2.4,3.989) A8(3.187,3.989) A9(4,3.989) B1(-2.401,3.201) B2(-1.613,3.201) B3(-0.8,3.201) B7(2.4,3.201) B8(3.187,3.201) B9(4,3.201) C1(-2.401,2.389) C2(-1.613,2.389) C3(-0.8,2.389) C7(2.4,2.389) C8(3.187,2.389) C9(4,2.389) D1(-2.401,1.601) D2(-1.613,1.601) D3(-0.8,1.601) D7(2.4,1.601) D8(3.187,1.601) D9(4,1.601) E1(-2.401,0.788) E2(-1.613,0.788) E3(-0.8,0.788) E7(2.4,0.788) E8(3.187,0.788) E9(4,0.788) F1(-2.401,0.001) F2(-1.613,0.001) F3(-0.8,0.001) F7(2.4,0.001) F8(3.187,0.001) F9(4,0.001) G1(-2.401,-0.812) G2(-1.613,-0.812) G3(-0.8,-0.812) G7(2.4,-0.812) G8(3.187,-0.812) G9(4,-0.812) H1(-2.401,-1.599) H2(-1.613,-1.599) H3(-0.8,-1.599) H7(2.4,-1.599) H8(3.187,-1.599) H9(4,-1.599) J1(-2.401,-2.412) J2(-1.613,-2.412) J3(-0.8,-2.412) J7(2.4,-2.412) J8(3.187,-2.412) J9(4,-2.412) K1(-2.401,-3.2) K2(-1.613,-3.2) K3(-0.8,-3.2) K7(2.4,-3.2) K8(3.187,-3.2) K9(4,-3.2) L1(-2.401,-4.012) L2(-1.613,-4.012) L3(-0.8,-4.012) L7(2.4,-4.012) L8(3.187,-4.012) L9(4,-4.012) M1(-2.401,-4.8) M2(-1.613,-4.8) M3(-0.8,-4.8) M7(2.4,-4.8) M8(3.187,-4.8) M9(4,-4.8) N1(-2.401,-5.612) N2(-1.613,-5.612) N3(-0.8,-5.612) N7(2.4,-5.612) N8(3.187,-5.612) N9(4,-5.612) P1(-2.401,-6.4) P2(-1.613,-6.4) P3(-0.8,-6.4) P7(2.4,-6.4) P8(3.187,-6.4) P9(4,-6.4) R1(-2.401,-7.213) R2(-1.613,-7.213) R3(-0.8,-7.213) R7(2.4,-7.213) R8(3.187,-7.213) R9(4,-7.213) T1(-2.401,-8) T2(-1.613,-8) T3(-0.8,-8) T7(2.4,-8) T8(3.187,-8) T9(4,-8)
L0603
  rect 0.8x0.864 smd: 1(-0.7,0) 2(0.7,0)
LED0603_GREEN
  rect 0.9x1 smd: 1(-0.85,0) 2(0.85,0)
LED0603_RED
  rect 0.9x1 smd: 1(-0.85,0) 2(0.85,0)
OSC-SMD_4P-L3.2-W2.5-BL
  rect 1.4x1.2 smd: 1(-1.1,-0.875) 2(1.1,-0.875) 3(1.1,0.875) 4(-1.1,0.875)
Pad_e492
  round 1.524 hole 0.914: 1(0,0)
Pad_e493
  round 1.524 hole 0.914: 1(0,0)
Pad_e494
  round 1.524 hole 0.914: 1(0,0)
Pad_e495
  round 1.524 hole 0.914: 1(0,0)
Pad_e496
  round 1.524 hole 0.914: 1(0,0)
PIN06
  rect 1.575x1.575 hole 0.914: 1(0,6.35)
  round 1.575 hole 0.914: 2(0,3.81) 3(0,1.27) 4(0,-1.27) 5(0,-3.81) 6(0,-6.35)
R0603
  rect 0.806x0.864 smd: 1(-0.753,0) 2(0.753,0)
R0805
  rect 1.133x1.377 smd: 1(-1,0) 2(1,0)
SOD-323F_L2.0-W1.6-LS2.5-RD
  rect 0.73x0.385 smd: 1(-1.185,0) 2(1.185,0)
SOP-8_L4.9-W3.9-P1.27-LS6.0-BL
  oval 0.63x1.865 smd: 1(-1.905,-2.683) 2(-0.635,-2.683) 3(0.635,-2.683) 4(1.905,-2.683) 5(1.905,2.683) 6(0.635,2.683) 7(-0.635,2.683) 8(-1.905,2.683)
TF-SMD_TF-15-15
  rect 1.6x0.701 smd: 1(-5.252,2.45) 2(-5.252,1.35) 3(-5.252,0.25) 4(-5.252,-0.85) 5(-5.252,-1.95) 6(-5.252,-3.05) 7(-5.252,-4.15) 8(-5.252,-5.25) 9(-5.252,-6.35)
  rect 1.6x1.8 smd: 10(-4.399,-8)
  rect 2.4x1.6 smd: 11(5.252,-7.6) 12(5.252,8)
  rect 1.399x1.801 smd: 13(-4.398,7.151)
TP_SMD
  custom 2x2 smd: P$1(0,0)
USB-C-SMD_TYPEC-304-BCP16
  oval 1x2.1 hole 0.6x1.8: 13(-4.32,1.633) 14(4.32,1.633)
  oval 1x1.6 hole 0.6x1.2: 15(-4.32,-2.547) 16(4.32,-2.547)
  rect 0.6x1.45 smd: A1B12(-3.225,2.547) A4B9(-2.45,2.547) B1A12(3.22,2.547) B4A9(2.45,2.547)
  rect 0.3x1.45 smd: A5(-1.25,2.547) A6(-0.25,2.547) A7(0.25,2.547) A8(1.25,2.547) B5(1.75,2.547) B6(0.75,2.547) B7(-0.75,2.547) B8(-1.75,2.547)
WQFN-24_L4.0-W4.0-P0.50-TL-EP2.7
  rect 0.85x0.25 smd: 1(-2.025,1.25) 2(-2.025,0.75) 3(-2.025,0.25) 4(-2.025,-0.25) 5(-2.025,-0.75) 6(-2.025,-1.25) 13(2.025,-1.25) 14(2.025,-0.75) 15(2.025,-0.25) 16(2.025,0.25) 17(2.025,0.75) 18(2.025,1.25)
  rect 0.25x0.85 smd: 7(-1.25,-2.025) 8(-0.75,-2.025) 9(-0.25,-2.025) 10(0.25,-2.025) 11(0.75,-2.025) 12(1.25,-2.025) 19(1.25,2.025) 20(0.75,2.025) 21(0.25,2.025) 22(-0.25,2.025) 23(-0.75,2.025) 24(-1.25,2.025)
  rect 2.7x2.7 smd: 25(0.001,0)
升压模块[MT3608]
  rect 8x3 smd: 1(-15.26,4.722) 2(-15.25,-1.703) 3(15.24,4.722) 4(15.24,-1.778)

## Nets
GND: C-AVCC-1.1 C-AVCC-2.1 C-AVCC-3.1 C-AVCC-4.1 C-AVCC-5.1 C-AVCC-6.1 C-FILTER-1.2 C-FILTER-2.2 C-FILTER-3.2 C-FILTER-4.2 C-FILTER-5.2 C-FILTER-6.2 C-FILTER-7.2 C-FILTER-8.1 C-FILTER-9.1 C-FILTER-10.2 C-FILTER-11.2 C-FILTER-12.1 C-FILTER-13.1 C-FILTER-14.1 C-FILTER-15.1 C-FILTER-16.1 C-FILTER-17.1 C-FILTER-18.1 C-FILTER-19.1 C-FILTER-20.2 C-FILTER-21.1 C-FILTER-22.2 C-FILTER-23.2 C-PLL-1.1 C-PLL-2.2 C-PLL-3.2 C-POWER-1.2 C-POWER-2.1 C-POWER-3.1 C-POWER-4.2 C-POWER-5.2 C-POWER-6.1 C-POWER-7.2 C-POWER-8.2 C-POWER-9.2 C-POWER-10.2 C-POWER-11.2 C-POWER-12.2 C-POWER-13.2 C-POWER-14.2 C-POWER-15.1 C-POWER-16.1 C-POWER-17.1 C-POWER-18.1 C-POWER-19.1 C-POWER-21.2 C-POWER-22.1 C-POWER-23.1 C-POWER-24.1 C-POWER-25.1 C-POWER-26.2 C-POWER-27.2 C-RESET-1.1 C-RESET-2.1 C-SOUND-3.1 C-SOUND-4.1 C_SD_1.2 C_WIFI_1.2 C_WIFI_2.1 C_WIFI_3.2 CN2.5 CN3.2 CN3.5 CN3.8 CN3.11 CN3.17 CN3.20 CN3.21 CN3.22 CN3.23 CN4.1 D45.3 D45.8 D46.3 D46.8 H1.3 H2.3 H3.2 H4.4 H5.2 H6.2 H7.1 J3.6 JOY1.3 JOY1.4 JOY1.a JOY1.b JP2.8 NOREF#3.1 NOREF#4.1 NOREF#5.1 R-AV-1.1 R-AV-2.2 R-POWER-1.1 R-POWER-4.1 R-POWER-5.1 R-POWER-6.1 R-POWER-8.2 R_LED_1.2 R_LED_2.2 R_WIFI_2.1 R_WIFI_4.1 RF1.2 RF1.3 RF1.4 RRAM1.1 RRAM2.1 RRAM3.1 RRAM4.1 RRAM5.1 RRAM7.2 TF1.6 TF1.10 TF1.11 TF1.12 TF1.13 U1.3 U2.4 U3#2.A1 U3#2.A10 U3#2.A18 U3#2.A21 U3#2.B6 U3#2.B16 U3#2.D19 U3#2.F14 U3#2.F15 U3#2.G13 U3#2.G14 U3#2.G15 U3#2.H10 U3#2.H11 U3#2.H12 U3#2.H13 U3#2.H14 U3#2.H15 U3#2.H18 U3#2.H19 U3#2.J12 U3#2.J13 U3#2.J14 U3#2.J15 U3#2.K8 U3#2.K9 U3#2.K10 U3#2.K11 U3#2.K12 U3#2.K13 U3#2.K14 U3#2.K15 U3#2.L21 U3#2.M1 U3#2.M2 U3#2.M3 U3#2.N6 U3#2.N9 U3#2.N12 U3#2.N15 U3#2.N18 U3#2.P3 U3#2.R5 U3#2.R21 U3#2.T1 U3#2.T3 U3#2.T8 U3#2.T10 U3#2.T15 U3#2.T17 U3#2.U6 U3#2.U13 U3#2.V1 U3#2.V5 U3#2.V12 U3#2.V19 U3#2.V21 U4.A9 U4.B1 U4.B3 U4.B9 U4.D1 U4.D8 U4.E1 U4.E2 U4.E8 U4.F9 U4.G1 U4.G8 U4.G9 U4.J2 U4.J8 U4.M1 U4.M9 U4.P1 U4.P9 U4.T1 U4.T9 U5.A9 U5.B1 U5.B3 U5.B9 U5.D1 U5.D8 U5.E1 U5.E2 U5.E8 U5.F9 U5.G1 U5.G8 U5.G9 U5.J2 U5.J8 U5.M1 U5.M9 U5.P1 U5.P9 U5.T1 U5.T9 U6.2 U6.13 U6.17 U6.18 U6.25 U7.8 U7.11 U7.37 U7.38 U7.41 U7.42 U7.48 U7.49 U7.54 U7.57 U8.2 U8.4 U9.1 U9.3 U9.20 U9.31 U9.33 U9.36 U10.18 U10.19 U10.20 U11.5 U11.6 USB1.13 USB1.14 USB1.15 USB1.16 USB1.A1B12 USB1.B1A12 X3.2 X3.4
VBAT: H3.1 U6.14
VCC25-DRAM: C-POWER-10.1 U7.19
VCC-5V: C-POWER-1.1 C-POWER-3.2 C-POWER-4.1 C-POWER-5.1 C-POWER-11.1 C-POWER-12.1 C-POWER-13.1 C-POWER-14.1 C-POWER-22.2 J2.1 JP1.2 L2.2 LED3.1 LED4.1 R-POWER-7.2 U6.15 U6.16 U7.3 U7.6 U7.13 U7.18 U7.30 U7.33 U7.34 U7.45 U7.46 U7.52 U7.53 U8.1
VCC-CPU: C-FILTER-12.2 C-FILTER-13.2 C-FILTER-18.2 C-FILTER-19.2 C-POWER-17.2 C-POWER-24.2 C-POWER-25.2 L1.2 U3#2.H8 U3#2.H9 U3#2.J8 U3#2.J9 U3#2.J10 U3#2.J11
VCC-CPUFB: U3#2.L8 U7.40
VCC-DRAM: C-FILTER-1.1 C-FILTER-3.1 C-FILTER-15.2 C-FILTER-16.2 C-POWER-16.2 L4.2 RRAM6.1 U3#2.L9 U3#2.L10 U3#2.L11 U3#2.L12 U3#2.L13 U4.A1 U4.A8 U4.B2 U4.C1 U4.C9 U4.D2 U4.D9 U4.E9 U4.F1 U4.G7 U4.H2 U4.H9 U4.K2 U4.K8 U4.N1 U4.N9 U4.R1 U4.R9 U5.A1 U5.A8 U5.B2 U5.C1 U5.C9 U5.D2 U5.D9 U5.E9 U5.F1 U5.G7 U5.H2 U5.H9 U5.K2 U5.K8 U5.N1 U5.N9 U5.R1 U5.R9 U7.9
VCC-GPU: C-FILTER-8.2 C-FILTER-9.2 C-FILTER-10.1 C-FILTER-11.1 C-POWER-2.2 C-POWER-26.1 C-POWER-27.1 L3.2 U3#2.F9 U3#2.F10 U3#2.F11 U3#2.F12 U3#2.F13 U3#2.G8 U3#2.G9 U3#2.G10 U3#2.G11 U3#2.G12
VCC-GPUFB: U3#2.F8 U7.47
ALDO1: C-FILTER-6.1 C-FILTER-17.2 C-POWER-6.2 D44.2 J3.1 R_HDMI_4.2 R_HDMI_5.2 U3#2.D10 U3#2.E18 U3#2.F5 U7.28
ALDO2: C-FILTER-7.1 C-POWER-7.1 U3#2.J6 U3#2.M18 U7.31 U7.32
AP-RESET: C-RESET-2.2 H6.1 R-RESET-2.1 U7.15
AV: C-AVCC-6.2 L6.1 U3#2.J21
AVOUT: C-AVCC-5.2 H1.2 L6.2 R-AV-2.1
B1: JOY1.c JOY1.d U2.3
BLDO1: C-FILTER-2.1 C-FILTER-4.1 C-FILTER-5.1 C-FILTER-14.2 C-POWER-8.1 R-RESET-1.2 U3#2.D7 U3#2.D11 U3#2.D12 U3#2.F18 U3#2.H20 U3#2.L14 U7.2 U9.22
BLDO2: C-POWER-9.1 U7.1
BLDO2_1: JOY1.1 JOY1.6 U1.1 U2.1
CHANGE_INT: U3#2.E2 U6.7
DEDCE: C-POWER-15.2 C_SD_1.1 H4.1 L5.2 R_SD_2.1 R_SD_3.1 R_WIFI_6.1 TF1.4 U7.10 U9.9 U10.7
EN-SCREEN: J1.1 U3#2.D3
EN_CHARGE: U3#2.F4 U6.9
EXT_PORT_1: CN2.6 U3#2.B13
EXT_PORT_2: CN5.1 U3#2.H5
EXT_PORT_3: CN5.2 U3#2.K6
GPO: H7.2 U7.14
H1: CN3.1 D45.1 D45.10 U3#2.C19
H2: CN3.3 D45.2 D45.9 U3#2.C20
H3: CN3.4 D45.4 D45.7 U3#2.D20
H4: CN3.6 D45.5 D45.6 U3#2.D21
H5: CN3.7 D46.1 D46.10 U3#2.E19
H6: CN3.9 D46.2 D46.9 U3#2.E20
H7: CN3.10 D46.4 D46.7 U3#2.F20
H8: CN3.12 D46.5 D46.6 U3#2.F21
MISO: J3.5
MOSI: J3.2
PMU-SCK: U3#2.C18 U6.5 U7.23
PMU-SDA: U3#2.B18 U6.6 U7.24
PRX: JOY1.2 U2.2
PRY: JOY1.5 U1.2
RESET: C-RESET-1.2 R-RESET-1.1 R-RESET-2.2 U3#2.A16
RGEN: C-POWER-21.1 R-POWER-3.1 R-POWER-4.2 U6.22
RST: J3.3
SA0: U3#2.P18 U4.N3 U5.N3
SA1: U3#2.R15 U4.P7 U5.P7
SA2: U3#2.T18 U4.P3 U5.P3
SA3: U3#2.R19 U4.N2 U5.N2
SA4: U3#2.U16 U4.P8 U5.P8
SA5: U3#2.R20 U4.P2 U5.P2
SA6: U3#2.N13 U4.R8 U5.R8
SA7: U3#2.T21 U4.R2 U5.R2
SA8: U3#2.V17 U4.T8 U5.T8
SA9: U3#2.T20 U4.R3 U5.R3
SA10: U3#2.U19 U4.L7 U5.L7
SA11: U3#2.U17 U4.R7 U5.R7
SA12: U3#2.P16 U4.N7 U5.N7
SA13: U3#2.R18 U4.T3 U5.T3
SA14: U3#2.P15 U4.T7 U5.T7
SA15: U3#2.U18 U4.M7 U5.M7
SBA0: U3#2.P20 U4.M2 U5.M2
SBA1: U3#2.U15 U4.N8 U5.N8
SBA2: U3#2.U20 U4.M3 U5.M3
SCAS: U3#2.N16 U4.K3 U5.K3
SCK: JP2.2 U3#2.H1
SCKE0: U3#2.V15 U4.K9 U5.K9
SCKE1: U3#2.P13 U4.J9 U5.J9
SCKN: RRAM8.2 U3#2.U14 U4.K7 U5.K7
SCKP: RRAM8.1 U3#2.T14 U4.J7 U5.J7
SCS0: U3#2.P21 U4.L2 U5.L2
SCS1: U3#2.N19 U4.L1 U5.L1
SDA: JP2.1 U3#2.H2
SDQ0: U3#2.N3 U4.H3
SDQ1: U3#2.U4 U4.F7
SDQ2: U3#2.N2 U4.G2
SDQ3: U3#2.T4 U4.F8
SDQ4: U3#2.U3 U4.H8
SDQ5: U3#2.P1 U4.E3
SDQ6: U3#2.T2 U4.H7
SDQ7: U3#2.P2 U4.F2
SDQ8: U3#2.P5 U4.A7
SDQ9: U3#2.V3 U4.D7
SDQ10: U3#2.P4 U4.C3
SDQ11: U3#2.R4 U4.C2
SDQ12: U3#2.R6 U4.C8
SDQ13: U3#2.N4 U4.A3
SDQ14: U3#2.P6 U4.B8
SDQ15: U3#2.N5 U4.A2
SDQ16: U3#2.T11 U5.F8
SDQ17: U3#2.U12 U5.H7
SDQ18: U3#2.T12 U5.H8
SDQ19: U3#2.U9 U5.F7
SDQ20: U3#2.T6 U5.F2
SDQ21: U3#2.U5 U5.H3
SDQ22: U3#2.T7 U5.G2
SDQ23: U3#2.T5 U5.E3
SDQ24: U3#2.R9 U5.A2
SDQ25: U3#2.P7 U5.D7
SDQ26: U3#2.N7 U5.C3
SDQ27: U3#2.P9 U5.A3
SDQ28: U3#2.P10 U5.C2
SDQ29: U3#2.U11 U5.B8
SDQ30: U3#2.P12 U5.A7
SDQ31: U3#2.R12 U5.C8
SDQM0: U3#2.U1 U4.E7
SDQM1: U3#2.R3 U4.D3
SDQM2: U3#2.T9 U5.E7
SDQM3: U3#2.N10 U5.D3
SDQS0N: U3#2.R1 U4.G3
SDQS0P: U3#2.R2 U4.F3
SDQS1N: U3#2.V2 U4.B7
SDQS1P: U3#2.U2 U4.C7
SDQS2N: U3#2.U8 U5.G3
SDQS2P: U3#2.V8 U5.F3
SDQS3N: U3#2.U10 U5.B7
SDQS3P: U3#2.V10 U5.C7
SODT0: U3#2.N20 U4.K1 U5.K1
SODT1: U3#2.N21 U4.J1 U5.J1
SOUNDL: C-SOUND-1.2 R_SOUND_1.1 U3#2.G19
SOUNDR: C-SOUND-2.2 R_SOUND_2.1 U3#2.G20
SRAS: U3#2.T16 U4.J3 U5.J3
SRST: U3#2.U21 U4.T2 U5.T2
SVREF: C-FILTER-22.1 C-FILTER-23.1 RRAM6.2 RRAM7.1 U4.H1 U4.M8 U5.H1 U5.M8
SWE: U3#2.V20 U4.L3 U5.L3
USB_4G_MODULE_DM: U3#2.L19 U11.2
USB_4G_MODULE_DP: U3#2.L20 U11.3
USB_KEYBOARD_D+: NOREF.1 U3#2.M20
USB_KEYBOARD_D-: NOREF#2.1 U3#2.M19
USB_MAIN_D+: U3#2.J20 USB1.A6 USB1.B6
USB_MAIN_D-: U3#2.J19 USB1.A7 USB1.B7
VCHARGE: C-POWER-23.2 U6.1 U6.24 USB1.A4B9 USB1.B4A9
$1N35: H2.1 U3#2.D16
$1N36: H2.2 U3#2.D15
$1N52: R_WIFI_1.2 U3#2.A6
$1N53: U3#2.C7 U9.16
$1N54: U3#2.C6 U9.18
$1N55: U3#2.B5 U9.19
$1N56: U3#2.C5 U9.14
$1N57: U3#2.B7 U9.15
$1N58: R_WIFI_2.2 U3#2.A2 U9.12
$1N59: U3#2.A8 U9.13
$1N60: R_WIFI_4.2 U3#2.C3 U9.6
$1N61: U3#2.B8 U9.7
$1N86: R_WIFI_3.2 U9.34
$1N87: R_WIFI_3.1 U3#2.B2
$1N132: C_WIFI_1.1 R_WIFI_5.1 RF1.1
$1N153: C_WIFI_2.2 R_WIFI_5.2 U9.2
$1N166: U3#2.A4 U9.43
$1N167: U3#2.B4 U9.42
$1N168: U3#2.C4 U9.44
$1N169: U3#2.B3 U9.41
$1N176: C_WIFI_3.1 U9.23
$1N181: R_WIFI_6.2 U3#2.C8 U9.24
$1N184: U3#2.B9 U9.25
$1N185: U3#2.B10 U9.26
$1N186: U3#2.C10 U9.27
$1N187: U3#2.C9 U9.28
$1N200: TF1.1 U3#2.L3
$1N201: TF1.2 U3#2.L2
$1N202: TF1.8 U3#2.J2
$1N203: TF1.7 U3#2.J3
$1N204: TF1.5 U3#2.K1
$1N205: R_SD_2.2 TF1.3 U3#2.K3
$1N216: R_SD_1.2 U3#2.K2
$1N217: R_SD_1.1 R_SD_3.2 TF1.9
$1N294: LED2.1 U3#2.G3
$1N295: LED1.1 U3#2.G2
$1N348: JP1.8 U3#2.B1
$1N349: JP1.7 U3#2.C1
$1N350: JP1.6 U3#2.D1
$1N351: JP1.5 U3#2.D2
$1N352: JP2.4 U3#2.E3
$1N353: JP2.3 U3#2.F1
$1N354: JP2.6 U3#2.F2
$1N355: JP2.7 U3#2.F3
$1N356: JP1.4 U3#2.C15
$1N357: JP1.3 U3#2.B15
$1N380: CN1.1 U3#2.A14
$1N381: CN1.2 U3#2.B14
$1N392: CN2.1 U3#2.C14
$1N393: CN2.2 U3#2.B12
$1N394: CN2.3 U3#2.C13
$1N395: CN2.4 U3#2.A12
$1N413: U3#2.L4 U10.16
$1N414: U3#2.L6 U10.15
$1N415: U3#2.E5 U10.14
$1N416: U3#2.K5 U10.13
$1N417: U3#2.K4 U10.12
$1N418: U3#2.L5 U10.11
$1N419: U3#2.D5 U10.10
$1N420: U3#2.E6 U10.9
$1N421: U3#2.G4 U10.8
$1N422: U3#2.H4 U10.6
$1N423: U3#2.G5 U10.5
$1N424: U3#2.E4 U10.4
$1N425: U3#2.G6 U10.3
$1N426: U3#2.D4 U10.2
$1N427: U3#2.H6 U10.1
$1N434: JP2.5 U3#2.H3
$1N478: JP1.1 U3#2.C2
$1N544: R_WIFI_1.1 U9.17
$1N545: LED1.2 R_LED_2.1
$1N546: LED2.2 R_LED_1.1
$3N159: L1.1 U7.43 U7.44
$3N160: L3.1 U7.50 U7.51
$3N161: L4.1 U7.7
$3N162: L5.1 U7.12
$3N441: U7.35 U7.36
$3N467: R-POWER-1.2 R-POWER-2.2 U7.26
$3N468: R-POWER-2.1 U7.25 U7.55
$3N484: C-POWER-18.2 U7.29
$3N499: U7.16 X2.P$1
$3N599: C-POWER-19.2 U6.23
$3N603: C-POWER-20.1 L2.1 U6.19 U6.20
$3N616: C-POWER-20.2 U6.21
$3N648: R_LED_4.2 U6.3
$3N649: R_LED_3.2 U6.4
$3N703: R-POWER-3.2 U6.11
$3N745: R-POWER-5.2 USB1.B5
$3N756: R-POWER-6.2 USB1.A5
$3N966: R-POWER-7.1 R-POWER-8.1 U7.27
$3N1006: H1.1 U8.3
$3N1013: LED4.2 R_LED_3.1
$3N1014: LED3.2 R_LED_4.1
$4N136: RRAM1.2 U4.L8
$4N137: RRAM2.2 U4.L9
$4N162: RRAM4.2 U5.L8
$4N163: RRAM3.2 U5.L9
$4N312: RRAM5.2 U3#2.L15
$5N103: H4.2 U3#2.K19
$5N104: H4.3 U3#2.K20
$5N125: C-PLL-2.1 U3#2.B11 X3.1
$5N136: C-PLL-1.2 U3#2.C12 X3.3
$5N216: C-PLL-3.1 U3#2.D13
$5N247: H5.1 U3#2.B17
$5N316: C-AVCC-1.2 U3#2.D18
$5N327: C-AVCC-2.2 U3#2.C17
$5N354: CN3.19 R_HDMI_1.1
$5N401: R_HDMI_3.2 U3#2.G21
$5N402: R_HDMI_2.2 U3#2.F19
$5N403: CN3.16 R_HDMI_3.1 R_HDMI_5.1
$5N404: CN3.15 R_HDMI_2.1 R_HDMI_4.1
$5N417: R_HDMI_6.2 U3#2.G17
$5N418: CN3.13 R_HDMI_6.1 R_HDMI_7.1
$5N419: R_HDMI_1.2 U3#2.G18
$5N451: D44.1 R_HDMI_7.2
$5N521: C-AVCC-3.2 U3#2.J18
$5N522: C-AVCC-4.2 U3#2.J17
$5N534: R-AV-1.2 U3#2.K18
$5N555: C-FILTER-20.1 C-FILTER-21.2 U3#2.H17
$5N607: C-SOUND-1.1 CN4.3
$5N608: C-SOUND-2.1 CN4.2
$5N658: C-SOUND-4.2 R_SOUND_2.2
$5N659: C-SOUND-3.2 R_SOUND_1.2

Pads without a net: CN3 14 18; CN4 4 5; CN6 1 2 3 4 5 6 7 8 9 10 11 12 13 14 15 16 17 18 19 20 21 22 23 24 25 26 27 28 29 30 31 32 33 34; CN7 1 2 3 4 5 6 7 8 9 10 11 12 13 14 15 16 17 18 19 20 21 22 23 24 25 26 27 28 29 30 31 32; J3 4; JOY1 7 8 9 10; U3 1 2 3 4 5 6 7 8; U3#2 A19 A20 B19 B20 B21 C11 C16 D14 L18; U6 8 10 12; U7 4 5 17 20 21 22 39 56; U9 4 5 8 10 11 21 29 30 32 35 37 38 39 40; U10 17; U11 1 4 7; USB1 A8 B8

## Via types
v1: diameter 0.4, hole 0.3, Top Layer to Bottom Layer, 462 vias
v2: diameter 0.61, hole 0.305, Top Layer to Bottom Layer, 25 vias
v3: diameter 0.399, hole 0.299, Top Layer to Bottom Layer, 4 vias

## Routing (per net, layer and track width the routed paths; a pad name or vN(x,y) marks a point on that pad's centre or on a via; arc(x,y) is an arc through that point)
GND: length 311.5
  Top Layer w0.203: 35.92,31.67 38.96,31.67 38.98,31.69
  Top Layer w0.254: CN3.20 92.8,46.38 NOREF#5.1 ; U1.3 91.44,81.22 JOY1.4 91.44,70.43 93.49,68.38 98.59,68.38 JOY1.3
  Bottom Layer w0.127: C-AVCC-4.1 44.56,41.2 R-AV-1.1 ; C-FILTER-16.1 22.78,32.13 C-FILTER-22.2 ; U3#2.A21 42.49,38.5 42.66,38.33 42.66,36.7 42.51,36.55 U3#2.A18 ; 14.1,40.45 13.74,40.09 12.91,40.09 v1(12.89,40.11) ; C-AVCC-3.1 47.55,41.16 C-AVCC-1.1 ; 35.55,15.75 35.55,16.38 36.63,17.46 36.63,18.54 ; C-FILTER-21.1 39.82,41.16 C-FILTER-20.2 ; v1(8.76,29.46) v1(8.76,27.94) 8.76,27.42 9.01,27.18 12.18,27.18 U4.T9 ; C-FILTER-2.2 C-FILTER-10.2
  Bottom Layer w0.132: 44.31,25.15 42.56,25.15 42.21,25.5 U3#2.A1 ; 14.1,20.59 14.1,20.56 14.34,20.32 15.36,20.32 15.7,20.66 U4.M1 ; 14.1,20.59 13.83,20.32 12.82,20.32 12.5,20.64 U4.T1 ; 14.1,20.59 U4.P1 ; 20.7,63.31 20.7,64.51 ; 20.7,64.51 20.3,64.11 U7.42 ; 20.7,64.51 21.9,65.71 ; CN3.17 93.01,39.69 93.08,39.62 93.08,37.59 92.83,37.34 ; 21.9,65.71 22.3,66.11 ; 21.9,65.71 U7.38 ; 22.3,66.11 U7.37 ; 22.3,66.11 22.7,66.51 ; 22.3,66.11 U7.48 15.76,66.11 ; 92.85,34.87 91.67,34.87 CN3.5 ; 92.85,34.87 93.08,35.1 93.08,35.81 92.83,36.07 ; 92.85,34.87 93.08,34.65 93.08,33.78 92.99,33.69 CN3.2 ; v1(32.4,25.02) 32.4,25.45 U3#2.T1 ; 22.1,20.46 22.24,20.32 23.48,20.32 23.7,20.54 23.7,21.1 ; 22.1,20.46 21.96,20.32 21.63,20.32 21.29,20.66 ; 22.1,20.46 U4.D1 ; 92.83,36.07 91.68,36.07 CN3.8 ; 92.83,36.07 93.08,36.32 93.08,37.08 92.83,37.34 ; 22.85,33.15 23.61,33.15 v1(24.09,33.63) 24.09,33.71 23.7,34.1 ; 22.85,33.15 22.85,32.32 C-FILTER-16.1 ; 22.85,33.15 22.34,33.15 22.1,33.39 22.1,33.42 ; U5.E2 22.08,34.1 U5.D1 22.1,33.42 ; 21.29,33.53 21.67,33.15 21.83,33.15 22.1,33.42 ; 21.29,33.53 21.29,33.36 21.05,33.12 20.08,33.12 19.69,33.51 19.69,33.54 ; 21.29,33.53 U5.E1 ; 12.89,40.11 U5.T9 ; 21.29,20.66 U4.E1 U4.E2 ; 21.29,20.66 20.94,20.32 20.21,20.32 19.69,20.84 U4.G1 ; 92.83,37.34 91.69,37.34 CN3.11 ; 34.47,34.6 U3#2.N15 ; v1(79.36,26.07) 80.16,26.07 80.23,26.14 ; U5.D8 22.1,39.77 22.44,40.1 23.31,40.1 23.7,40.5 ; 38,33.3 38,33.59 v1(37.99,33.6) ; C-POWER-2.1 15.37,67.05 15.37,66.51 15.76,66.11 ; 15.76,66.11 15.68,66.03 C-POWER-14.2 ; U3#2.N18 34.4,36.32 33.69,35.6 32.75,35.6 U3#2.T17 ; U7.57 21.1,68.51 U7.54 ; U7.57 22.7,66.51 ; U7.57 23.1,66.91 ; 19.69,33.54 19.29,33.15 18.66,33.15 18.48,33.32 18.48,34.49 U5.J2 ; 19.69,33.54 U5.G1 ; U5.M1 15.7,33.26 v1(16.13,32.83) ; v1(30.6,24.89) 31.15,25.45 U3#2.V1 ; v1(42.81,31.34) 42.81,31.35 U3#2.A10 ; U9.33 79.11,29 v1(79.11,28.19) ; 32.78,27.13 32.78,27.78 U3#2.R5 ; U4.P9 14.1,28.18 ; 14.1,28.18 14.1,28.21 14.42,28.52 15.28,28.52 15.7,28.1 U4.M9 ; 14.1,28.18 13.76,28.52 12.97,28.52 v1(12.94,28.5) 12.5,28.06 U4.T9 ; U3#2.H19 37.56,37.11 37.56,36.47 v1(37.33,36.25) 37.38,36.25 37.68,36.55 U3#2.H18 ; C-POWER-16.1 21.78,74.8 22.48,74.1 22.48,71.56 23.1,70.94 U7.8 23.1,66.91 ; 23.1,66.91 24.3,68.11 U7.11 24.26,70.15 24.26,70.62 25.27,71.64 25.27,74.16 C-POWER-15.1 ; R-POWER-5.1 6.1,19.93 USB1.14 ; v2(8.81,37.59) 8.81,34.48 9.11,34.18 12.42,34.18 U5.T1 ; v1(24.12,35.31) 24.09,35.31 23.7,35.7 ; 22.7,66.51 U7.49 ; v1(18.48,22.28) 18.09,21.89 U4.J2 ; U5.P1 14.11,34.09 v1(14.11,33.53) ; 23.7,27.5 U4.A9 ; U4.D8 U4.E8 v1(20.89,27.09) 20.5,27.47 U4.F9 U4.G9 U4.G8 ; v1(77.33,28.19) 77.33,28.7 ; RRAM5.1 v1(44.8,33.79) 45.54,33.79 X3.2 ; v1(33.42,26.47) U3#2.P3 ; v1(31.49,32.33) 31.17,32.65 U3#2.V12 ; v3(30.86,27.81) U3#2.V5
  Bottom Layer w0.135: v1(41.9,28.45) 41.6,28.75 U3#2.B6
  Bottom Layer w0.147: 21.71,39.69 v1(21.71,39.37) ; 21.71,39.69 U5.D8 ; 21.71,39.69 U5.E8 20.69,40.29 20.69,40.31 U5.F9 U5.G9 U5.G8 ; 23.7,40.5 U5.A9
  Bottom Layer w0.152: U3#2.B16 41.87,34.93
  Bottom Layer w0.157: v1(16.12,40.12) 15.74,40.5 U5.M9
  Bottom Layer w0.158: U3#2.T15 33.14,33.91 ; 33.14,33.91 33.14,33.27 32.88,33.02 32.08,33.02 31.8,33.3 ; 33.14,33.91 33.27,33.78 34.15,33.78 34.47,34.1 34.47,34.6 ; v1(28.51,40.18) 28.77,40.18 30.45,38.5 U3#2.V21 ; X3.4 47.47,29.64 C-PLL-2.2 ; U3#2.R21 33.1,40.86 v1(33.39,41.15) 33.39,41.91 32.88,42.42 32.37,42.42 C-FILTER-7.2 ; U3#2.N6 34.45,28.75 34.91,29.21 34.91,30.48 34.69,30.7 34.63,30.7 ; 32.78,27.13 32.78,27.13 U3#2.T3 ; v1(18.49,39.28) 18.49,39.28 U5.J8 ; v1(24.12,23.11) 23.7,22.7 23.7,22.7 ; U3#2.V19 31.16,37.19 v1(31.16,36.7) ; U4.A9 24.69,27.5 v1(25.01,27.81) ; v1(37.96,34.29) 37.98,34.27 37.98,33.95 ; 45.9,35.56 45.9,33.79 X3.2 ; 34.63,30.7 U3#2.N9 ; 34.63,30.7 34.91,30.99 34.91,32.79 v1(34.74,32.97) 34.72,32.97 U3#2.N12 ; U3#2.U6 31.61,28.94 31.61,29.21 U3#2.T8 32.14,30.36 32.14,30.46 32.12,30.48 32.12,31.02 U3#2.T10 ; v1(39.92,36.88) 39.93,36.88 U3#2.D19 ; 15.36,20.32 16.37,19.3 RRAM7.2
  Bottom Layer w0.203: 7.47,70.6 U6.25 ; 7.47,70.6 7.97,71.1 U6.18 ; 7.47,70.6 U6.17 ; U6.25 7.47,69.1 U6.2 ; U6.25 5.47,71.1 U6.13 ; v1(38.72,44.2) 38.6,44.2 37.71,43.31 37.71,41.87 C-FILTER-2.2 ; U3#2.N18 35.17,35.78 35.17,35.05 34.72,34.6 34.47,34.6 ; U3#2.H13 U3#2.G13 ; U3#2.T3 32.45,26.8 v1(32.12,26.47) ; U3#2.M3 U3#2.M2 U3#2.M1 35.05,24.77 32.55,22.28 v1(32.22,22.28) ; C-FILTER-21.1 39.81,42.67 C-AVCC-2.1 ; 35.7,41.02 U3#2.L21 ; U3#2.J12 U3#2.H12
  Bottom Layer w0.254: 61.84,42.67 60.06,40.89 54.79,40.89 C-AVCC-5.1 ; U2.4 89.65,57.43 89.68,57.45 89.68,57.54 ; C-FILTER-13.1 34.99,22.29 v1(33.82,21.12) ; JOY1.b 89.68,57.54 ; 89.68,57.54 JOY1.a ; 89.68,57.54 89.68,67.11 90.95,68.38 98.59,68.38 JOY1.3 ; 29.94,43.69 C-FILTER-19.1 26.83,43.69 C-POWER-25.1 ; 29.94,43.69 29.9,43.73 C-POWER-27.2 ; 29.94,43.69 C-FILTER-7.2 ; v1(33.39,41.15) 34.21,41.15 C-FILTER-12.1 ; C-FILTER-9.1 25.93,57.15 U11.5 ; U4.J8 18.47,26.31 v1(18.49,26.31) ; R_LED_1.2 R_LED_2.2
  Bottom Layer w0.305: U3#2.H10 U3#2.H11 U3#2.H12 U3#2.H13 ; U3#2.K8 U3#2.K9 36.54,30.89 36.54,31.16 U3#2.K10 U3#2.K11 U3#2.K12 36.46,32.76 36.46,33.19 U3#2.K13 U3#2.K14 U3#2.K15 U3#2.J15 U3#2.H15 U3#2.G15 U3#2.F15 U3#2.F14 U3#2.G14 U3#2.H14 U3#2.J14 U3#2.J13 U3#2.J12 ; D45.8 D45.3 86.7,34.04 v1(86.63,33.96) ; 85.64,36.07 D46.3 84.11,36.07 v1(83.99,36.19)
  vias: v1(14.09,20.32) v1(22.1,20.32) v1(24.95,19.3) v1(31.1,62.48) v1(31.1,61.21) v1(31.51,29.06) v1(32.81,33.12) v1(35.7,41.02) v1(37.38,31.67) v1(41.87,34.92) v1(42.53,36.83) v1(47.81,27.31) v1(65.96,28.96) v1(76.29,9.47) v1(76.29,8) v1(76.77,7.04) v1(77.08,16.76) v1(77.08,15.49) v1(77.08,14.22) v1(77.08,13.21) v1(77.08,11.94) v1(77.08,10.67) v1(78.04,7.06) v1(79.11,16.26) v1(79.11,14.73) v1(79.11,13.72) v1(79.11,12.7) v1(79.11,11.43) v1(79.11,10.16) v1(79.31,7.06) v1(79.95,9.45) v1(79.95,8.03) v2(8.71,40.13) v2(8.76,38.86)
VBAT: length 6.5
  Top Layer w0.254: H3.1 5.96,75.18 v1(5.96,73.66)
  Bottom Layer w0.254: v1(5.96,73.66) 5.97,73.65 U6.14
VCC25-DRAM: length 1.8
  Bottom Layer w0.132: C-POWER-10.1 26.34,67.75 U7.19
VCC-5V: length 142.7
  Top Layer w0.254: v1(0.62,46.74) 0.62,49.28
  Inner3 w0.254: JP1.2 52.36,21.64 52.03,21.31 52.03,6.1 21.96,6.1 0.62,27.43 v1(0.62,46.74)
  Bottom Layer w0.132: 19.5,64.91 U7.46
  Bottom Layer w0.152: U7.30 25.1,62.57 24.77,62.24 C-POWER-11.1 ; U7.13 25.1,70.45 25.31,70.66 26.07,70.66 v2(26.28,70.87)
  Bottom Layer w0.158: v1(30.6,62.99) 29.58,62.99
  Bottom Layer w0.203: 19.5,64.91 v2(18.6,64.91) 18.26,64.91 17.9,65.28 17.16,65.28 C-POWER-14.1 ; 18.66,68.07 v2(18.7,68.11) U7.53 U7.52 ; U7.34 23.5,62.88 23.1,62.48 21.71,62.48 21.21,61.99 v1(21.21,61.08) ; U7.18 26.82,68.11 27.29,68.58 27.29,69.09 27.55,69.34 v2(28.06,69.34) ; U7.6 22.3,70.5 21.68,71.12 v2(21.2,71.12) 21.1,71.02 U7.3 ; 7.23,74.93 6.72,75.44 2.1,75.44 1.89,75.23 LED4.1 1.81,74.42 1.13,74.42 0.88,74.17 0.88,70.87 1.3,70.45 LED3.1
  Bottom Layer w0.254: U7.33 U7.34
  Bottom Layer w0.305: v1(21.21,61.08) C-POWER-1.1 ; C-POWER-4.1 17.39,70.42 v2(17.39,71.37) 14.34,71.37 12.74,72.98 L2.2
  Bottom Layer w0.355: C-POWER-13.1 27.55,73.15 27.04,72.64 27.04,71.63 v2(26.28,70.87)
  vias: v1(11.29,74.42) v1(12.05,52.07) v1(13.22,52.05) v1(14.34,52.07) v1(25.01,62.23) v1(28.12,59.44)
VCC-CPU: length 64
  Top Layer w0.203: C-POWER-24.2 37.45,30.85 v1(37.31,31)
  Inner3 w0.305: v2(33.64,42.67) 33.64,41.91 35.42,40.13 35.42,35.31 36.92,33.81 36.92,31.39 v1(37.31,31) 37.45,30.85 37.45,28.96 37.96,28.45 37.96,23.34 v1(35.14,20.51)
  Inner3 w0.457: 17.39,60.71 17.39,58.42 19.42,56.39 23.99,56.39 27.29,53.09 27.29,49.28 v1(30.15,46.42) 33.64,42.93 v2(33.64,42.67)
  Bottom Layer w0.158: v2(33.64,42.67) 33.9,42.42 34.41,42.42
  Bottom Layer w0.203: v1(30.15,46.42) 29.96,46.23 28.56,46.23 28.31,45.97 C-FILTER-19.2 26.83,45.09 C-POWER-25.2 ; v1(37.31,31) 37.28,31.03 37,31.03
  Bottom Layer w0.254: C-FILTER-18.2 34.35,19.72 v1(35.14,20.51)
  Bottom Layer w0.305: U3#2.H9 U3#2.H8 U3#2.J8 U3#2.J9 U3#2.J10 36.79,31.56 36.79,31.79 U3#2.J11
  vias: v2(17.33,60.71)
VCC-CPUFB: length 41.8
  Inner4 w0.127: v1(35.5,29.52) 35.29,29.72 35.29,40.77 35.17,40.89 35.17,43.18 27.55,50.8 27.55,52.83 23.99,56.39 22.21,56.39 21.71,56.9 21.71,62.23 21.45,62.48 v1(20.94,62.48)
  Bottom Layer w0.152: v1(35.5,29.52) 35.5,29.85 U3#2.L8
  Bottom Layer w0.203: v1(20.94,62.48) 21.1,62.64 U7.40
VCC-DRAM: length 217.6
  Top Layer w0.203: 35.92,30.27 36.01,30.35 v1(36.01,31.01)
  Inner3 w0.132: v1(19.29,38.35) 19.42,38.23 19.42,36.58 18.91,36.07 18.91,34.87 ; v1(19.29,38.35) 19.29,38.78 20.39,39.88 ; v1(19.29,38.35) 18.91,38.35 17.97,39.29 v1(17.72,39.29) ; v1(19.29,38.35) 18.66,37.72 14.75,37.72 14.37,37.34 10.53,37.34 10.28,37.59 ; v1(16.93,26.34) 15.18,26.34 14.49,27.03 v1(14.49,28.02) 14.47,27.99 v1(13.12,27.99) ; 18.91,34.87 18.53,35.25 v1(16.93,35.25) 15.56,35.25 14.85,34.54 14.85,33.53 v1(14.9,33.48) ; 18.91,34.87 v1(19.27,34.52) 19.45,34.52 v1(20.44,33.53) ; 22.54,20.73 21.38,20.73 ; 22.54,20.73 22.53,20.73 v1(22.53,21.45) ; 22.54,20.73 v1(24.88,20.73) ; 21.38,20.73 20.87,20.73 v1(19.29,22.3) ; 21.38,20.73 21.38,24.1 v1(20.03,25.45) 20.03,27.03 20.87,27.86 v1(21.68,27.86) ; 20.39,39.88 19.42,39.88 17.9,41.4 14.34,41.4 13.88,40.94 v1(13.68,40.94) ; 20.39,39.88 23.56,39.88 v1(24.12,39.32) ; v1(20.44,33.53) 21.68,32.28 v1(21.68,27.86) ; v1(20.44,33.53) 22.21,33.53 23.15,34.47 ; 15.36,20.73 v1(15.13,20.7) ; 15.36,20.73 v1(20.77,20.73) ; 15.36,20.73 13.6,20.73 v1(13.58,20.7) ; v1(21.68,27.86) 21.71,27.84 21.71,27.43 22.61,26.53 24.48,26.53 v1(25.01,27.05)
  Inner3 w0.147: v1(9.77,33.78) 10.28,34.29 12.05,34.29 12.82,33.53 13.32,33.53 13.83,33.02 14.44,33.02 v1(14.9,33.48) ; v1(20.03,25.45) 19.57,25.91 17.9,25.91 17.46,26.34 v1(16.93,26.34)
  Inner3 w0.158: v1(16.93,22.28) 16.51,21.85 16.51,20.79 ; 35.93,33.02 35.33,33.62 33.29,33.62 32.88,34.04 31.16,34.04 31.03,33.91 24.88,33.91 24.29,34.5 v1(23.28,34.5)
  Inner3 w0.203: 29.58,45.47 31.76,43.28 31.76,39.22 34.15,36.83 34.15,35.31 34.41,35.05 34.69,35.05 36.01,33.74 v1(36.01,32.97)
  Inner3 w0.355: v1(24.12,39.32) 24.12,40 29.58,45.47 26.02,49.02 26.02,52.32 23.23,55.12 19.17,55.12 16.78,57.51 16.78,59.54 15.1,61.21 15.1,74.42 15.61,74.93 v2(23.23,74.93)
  Bottom Layer w0.102: 18.25,41.15 18.22,41.18 15.14,41.18 15.1,41.15
  Bottom Layer w0.127: 23.93,32.26 24.49,32.82 U5.A1
  Bottom Layer w0.132: U5.G7 19.69,38.75 v1(19.29,38.35) ; U4.R1 13.58,20.81 v1(13.58,20.7) ; U4.C1 v1(22.53,21.45) U4.D2 ; U5.K2 v1(16.93,35.25) ; 15.1,41.15 14.85,40.89 14.85,40.54 U5.N9 ; v1(19.29,22.3) 19.29,22.28 U4.H2 ; U5.N1 14.89,33.49 v1(14.9,33.48) ; U5.F1 20.5,33.59 v1(20.44,33.53) ; U5.A1 23.69,34.9 v1(23.28,34.5) U5.C1 U5.D2 ; v1(15.13,20.7) 15.13,20.86 U4.N1 ; v1(14.49,28.02) 14.89,27.62 U4.N9 ; U4.F1 20.77,20.83 v1(20.77,20.73) ; U5.H2 19.27,34.52 ; U4.R9 13.29,27.82 v1(13.12,27.99) ; 23.7,21.89 U4.A1 24.86,20.73 v1(24.88,20.73) ; U4.C9 U4.D9 U4.E9 20.85,27.94 19.34,27.94 U4.H9 ; 18.25,41.15 U5.H9 19.29,40.89 20.94,40.89 21.29,40.55 U5.E9 U5.D9 U5.C9 ; U4.K2 17.3,21.91 v1(16.93,22.28)
  Bottom Layer w0.147: U4.K8 16.95,26.34 v1(16.93,26.34) ; U5.R1 12.87,33.68 11.4,33.68 11.17,33.9 9.89,33.9 v1(9.77,33.78)
  Bottom Layer w0.157: v1(17.72,39.29) 17.35,39.66 17.33,39.66 ; U5.R9 13.29,40.55 v1(13.68,40.94) 14.8,40.94 14.85,40.89
  Bottom Layer w0.158: U4.A8 24.64,26.69 v1(25.01,27.05) ; RRAM6.1 23.46,19.3 v1(24.88,20.73) ; v1(21.68,27.86) 21.65,27.86 U4.E9 ; U4.G7 20.03,25.56 v1(20.03,25.45) ; v1(24.12,39.32) U5.A8
  Bottom Layer w0.203: v1(36.01,32.97) 35.99,32.98 35.7,32.98 ; v1(36.01,31.01) 36,31.02 35.7,31.02
  Bottom Layer w0.305: U3#2.L9 U3#2.L10 U3#2.L11 U3#2.L12 U3#2.L13
  Bottom Layer w0.457: v2(23.23,74.93) 23.18,74.88 C-POWER-16.2
  vias: v2(10.21,37.59)
VCC-GPU: length 64.6
  Top Layer w0.203: v1(38.63,30.99) 38.98,30.64 C-POWER-26.1
  Inner3 w0.355: v1(38.63,30.99) 38.63,31.59 37.45,32.77 37.45,34.06 35.88,35.64 35.88,36.93 36.06,37.11 36.06,38.99 36.95,39.88 36.26,40.56 36.26,41.15 28.06,49.35 28.06,53.34 24.25,57.15 v1(23.54,57.15) 19.93,57.15 v1(19.17,57.91) 18.15,58.93 18.15,64.01 15.86,66.29 15.86,68.58
  Bottom Layer w0.203: 28.76,47.5 29.94,47.5 v1(32.12,45.31) 32.02,45.21 C-POWER-27.1 ; v1(38.63,30.99) 38.63,30.7
  Bottom Layer w0.305: U3#2.G9 U3#2.F9 U3#2.F10 U3#2.F11 U3#2.F12 U3#2.F13 ; U3#2.G9 U3#2.G10 U3#2.G11 U3#2.G12 ; U3#2.G9 U3#2.G8 ; L3.2 v2(15.86,68.59) 15.23,68.59 15.11,68.7
  vias: v1(36.82,39.93)
VCC-GPUFB: length 51.5
  Inner4 w0.127: v1(18.48,65.71) 18.55,65.79 21.2,65.79 21.96,65.02 21.96,57.15 22.47,56.64 24.5,56.64 27.8,53.34 27.8,51.05 34.66,44.2 35.93,44.2 36.18,43.94 36.18,40.89 35.57,40.28 35.57,35.41 36.69,34.29 36.69,29.97 37.2,29.46 v1(38.98,29.46)
  Bottom Layer w0.152: v1(38.98,29.46) 38.98,30.02 U3#2.F8
  Bottom Layer w0.203: U7.47 v1(18.48,65.71)
(no net): length 9.6
  Bottom Layer w0.158: CN6.1 87.14,64.42 CN7.2 ; 86.73,66.32 86.73,64.82 86.42,64.51 CN7.4 ; CN7.28 82.22,64.36 81.93,64.64 81.93,66.31 CN6.27 ; CN7.30 81.54,64.37 CN6.29
ALDO1: length 153.5
  Inner3 w0.132: v1(39.79,31.67) 39.66,31.67 39.5,31.51 39.5,28.69 v1(39.26,28.45)
  Inner3 w0.158: v1(36.41,44.48) 36.41,43.21 37.45,42.16 37.45,41.4 38.47,40.39 38.47,39.12 38.72,38.86 42.53,38.86 42.92,38.48 42.92,36.67 42.57,36.32 39.99,36.32 v1(39.64,35.97)
  Inner3 w0.203: v1(46.41,27.31) 43.42,27.31 42.79,27.94 41.75,27.94 40.73,28.96 39.59,28.96
  Bottom Layer w0.109: U3#2.E18 39.6,36 v1(39.64,35.97)
  Bottom Layer w0.132: v1(39.64,35.97) 39.49,35.81 39.49,31.98 v1(39.79,31.67) 39.93,31.67 U3#2.D10 ; v1(39.26,28.45) 39.26,28.41 U3#2.F5
  Bottom Layer w0.158: 28.06,61.98 28.12,61.91 C-POWER-6.2 ; 28.06,61.98 27.55,61.98 26.28,63.25 26.28,64.01 ; 28.06,61.98 31.1,61.98 32.37,60.71 32.37,46.99 34.15,45.21 36.43,45.21 ; 36.43,45.21 87.49,45.21 88,44.7 88,42.62 87.77,42.39 ; 36.43,45.21 36.41,45.19 v1(36.41,44.48) ; R_HDMI_5.2 87.77,42.39 ; 87.77,42.39 88,42.16 88,39.62 87.75,39.37 87.25,39.37 R_HDMI_4.2 87.24,39.41 87.24,39.88 86.98,40.13 D44.2
  Bottom Layer w0.203: C-FILTER-6.1 37.13,44.48 v1(36.41,44.48) ; J3.1 3.93,57.4 22.21,57.4 22.98,58.17 32.24,58.17 32.37,58.3
